# EasyEDA Pro project energymonitor.eprj, board PCB_1
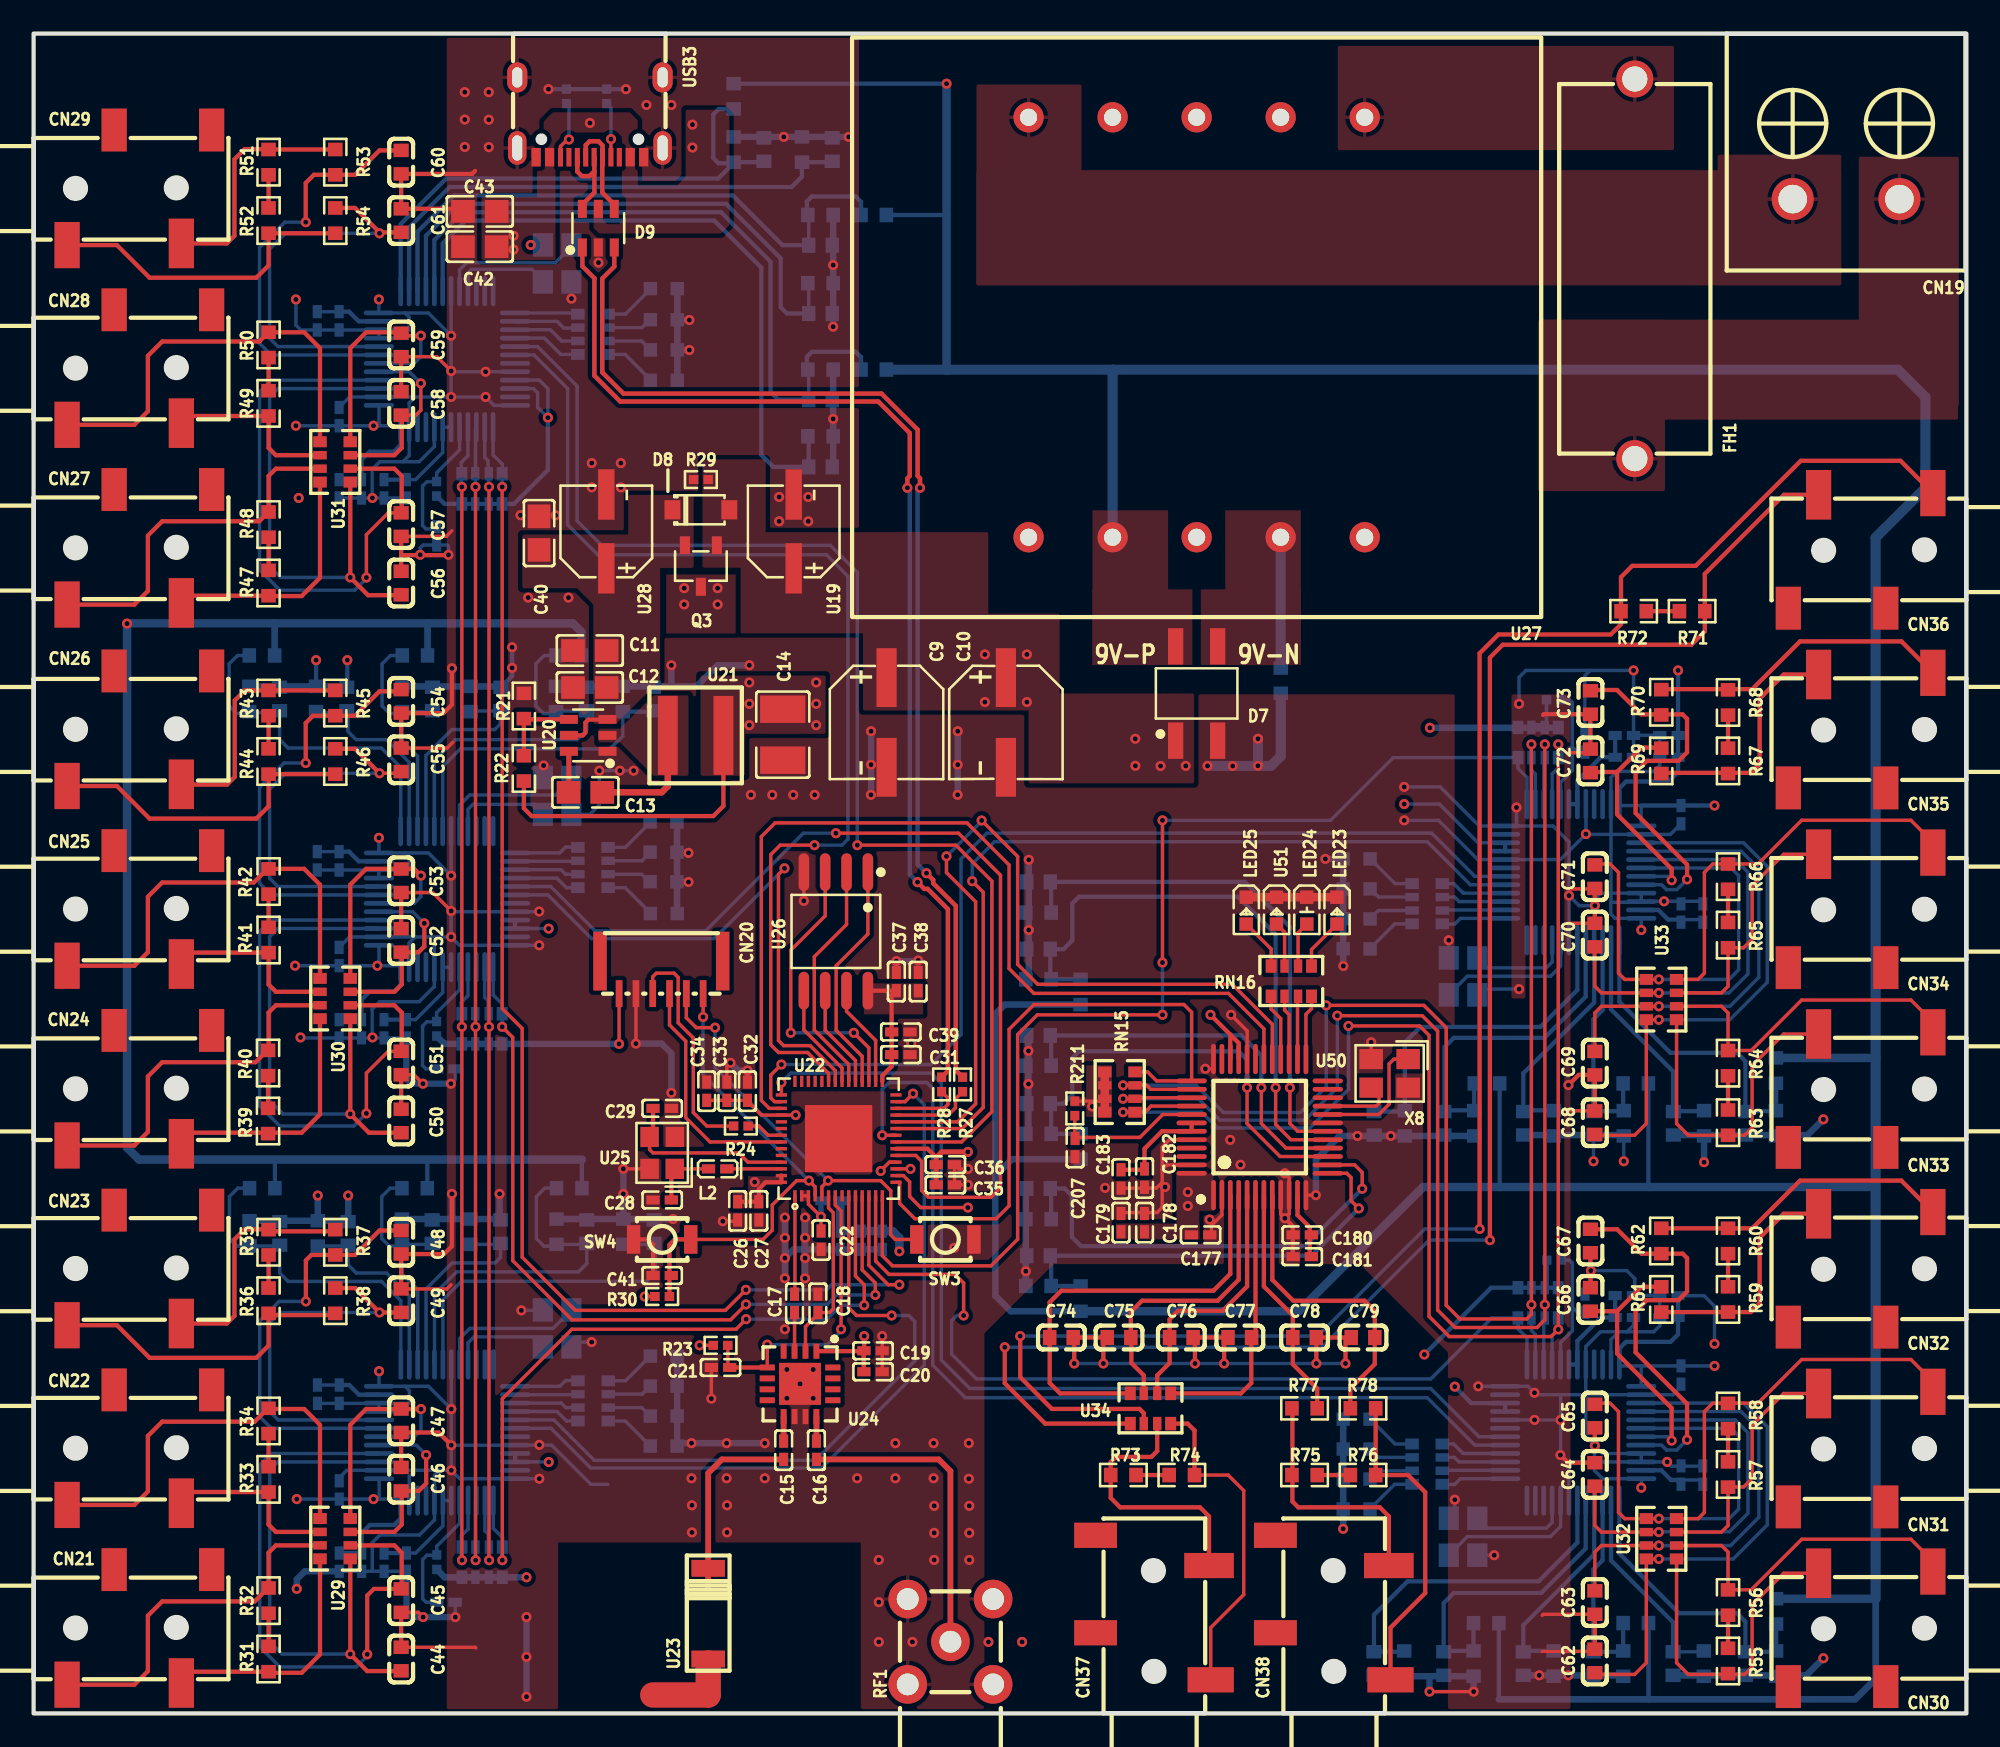
[diagram p6: board, top side]
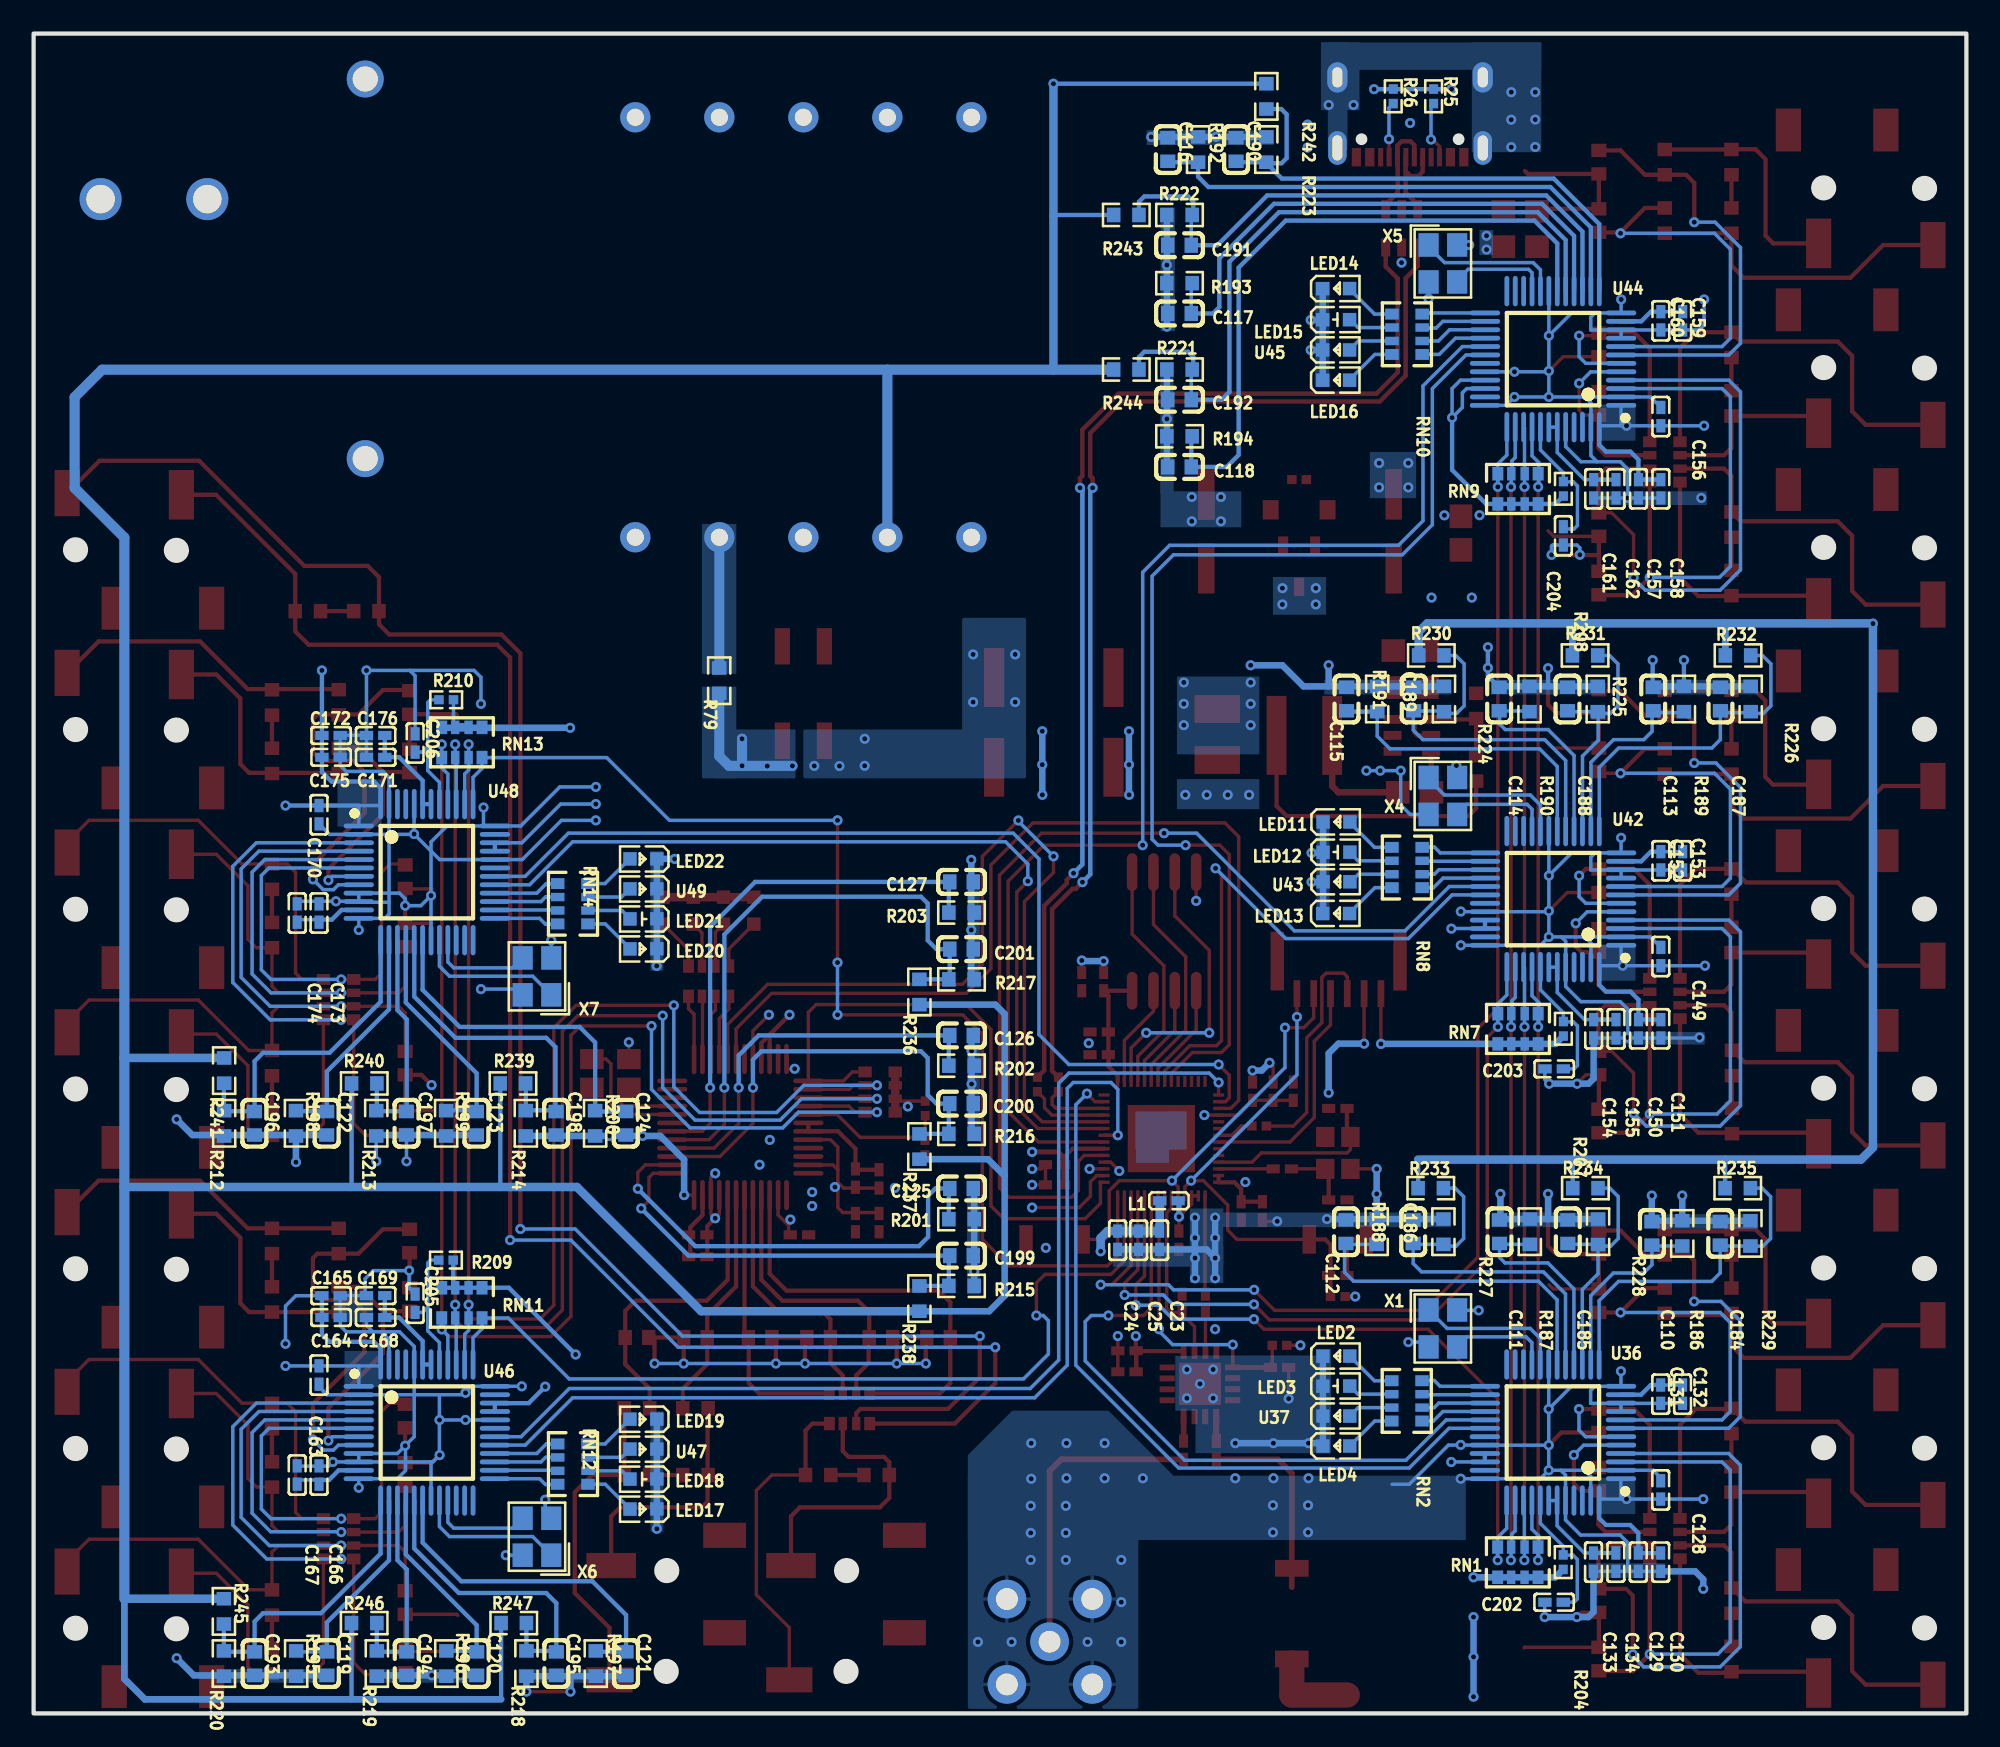
[diagram p7: board, bottom side, seen from below]

Outline 115 x 100 mm; copper layers: Top Layer, Inner1, Inner2, Bottom Layer. Coordinates in mm from the lower left corner of the outline.
Outline path: rectangle 0,100 115,0
Stack: Top Layer 0.035mm Outer layer thickness 1oz / Dielectric1 0.2104mm 7628 RC49% 8.6mil / Inner1 0.0152mm Inner layer thickness / Dielectric2 1.065mm 1.1mm H/HOZ Copper / Inner2 0.0152mm Inner layer thickness / Dielectric3 0.2104mm 7628 RC49% 8.6mil / Bottom Layer 0.035mm Outer layer thickness 1oz

## Design rules (mm)
net ANT1: 50 OHM
net ANT2: 50 OHM
net $1N20967: DP1
net $1N20955: DP1
net USB_D_N: DP2
net USB_D_P: DP2
template: User Custom Config
spacing copperThickness1oz (default): track to track 0.152, other pairs 0.152 to 0.3
spacing copperThickness2oz: track to track 0.203, other pairs 0.152 to 0.3
track width copperThickness1oz (default): min 0.203, default 0.203, max 0.6
track width copperThickness2oz: min 0.203, default 0.254, max 2.54
track width 50OHM: min 0.343, default 0.343, max 0.343
differential pair USB Diff (default): width min 0.267, default 0.267, max 0.267; gap min 0.203, default 0.203
via viaSize (default): diameter min 0.6, default 0.6, max 0.6; hole min 0.3, default 0.3, max 0.3
['net', 'ant1'] ['NET', 'ANT2'] uses default

## Placement (name value [footprint] x y rotation side)
C9  220uF  [CAP-SMD_BD6.3-L6.6-W6.6-FD]  57.85 58.99 270 top
C10  220uF  [CAP-SMD_BD6.3-L6.6-W6.6-FD]  50.75 58.99 270 top
C11  2.2uF  [C0805]  33.1 63.27 0 top
C12  100nF  [C0805]  33.1 61.07 0 top
C13  100nF  [C0805]  32.83 54.83 0 top
C14  100uF  [C1210]  44.57 58.26 90 top
C15  100pF  [C0402]  44.63 15.67 270 top
C16  100pF  [C0402]  46.58 15.67 270 top
C17  100pF  [C0402]  45.28 24.41 270 top
C18  100pF  [C0402]  46.67 24.41 270 top
C19  100pF  [C0402]  49.94 21.59 180 top
C20  100nF  [C0402]  49.94 20.34 180 top
C21  100pF  [C0402]  40.87 20.59 0 top
C22  100nF  [C0402]  46.85 28.17 90 top
C23  100nF  [C0402]  48 28.17 90 bottom
C24  10uF  [C0402]  50.5 28.17 90 bottom
C25  1uF  [C0402]  49.25 28.17 90 bottom
C26  1uF  [C0402]  41.89 29.92 90 top
C27  10nF  [C0402]  43.15 29.92 270 top
C28  10pF  [C0402]  37.4 30.57 0 top
C29  10pF  [C0402]  37.4 36.02 180 top
C31  100nF  [C0402]  51.6 39.22 180 top
C32  100nF  [C0402]  42.48 37.04 270 top
C33  1uF  [C0402]  41.25 37.04 270 top
C34  10uF  [C0402]  40.05 37.04 270 top
C35  10uF  [C0402]  54.25 31.47 180 top
C36  100nF  [C0402]  54.25 32.67 180 top
C37  100nF  [C0402]  51.33 43.57 270 top
C38  10uF  [C0402]  52.63 43.57 270 top
C39  1uF  [C0402]  51.6 40.57 180 top
C40  100nF  [C0805]  30.07 70.26 270 top
C41  1uF  [C0402]  37.4 26.07 0 top
C42  2.2uF  [C0805]  26.55 87.32 0 top
C43  100nF  [C0805]  26.55 89.42 0 top
C44  330nF  [C0603]  21.87 3.24 90 top
C45  330nF  [C0603]  21.87 6.71 90 top
C46  330nF  [C0603]  21.87 13.94 90 top
C47  330nF  [C0603]  21.87 17.42 90 top
C48  330nF  [C0603]  21.87 28.05 270 top
C49  330nF  [C0603]  21.87 24.57 270 top
C50  330nF  [C0603]  21.87 35.27 90 top
C51  330nF  [C0603]  21.87 38.72 90 top
C52  330nF  [C0603]  21.87 46.02 90 top
C53  330nF  [C0603]  21.87 49.57 90 top
C54  330nF  [C0603]  21.87 60.25 270 top
C55  330nF  [C0603]  21.87 56.77 270 top
C56  330nF  [C0603]  21.87 67.29 90 top
C57  330nF  [C0603]  21.87 70.77 90 top
C58  330nF  [C0603]  21.87 77.99 90 top
C59  330nF  [C0603]  21.87 81.47 90 top
C60  330nF  [C0603]  21.87 92.35 270 top
C61  330nF  [C0603]  21.87 88.87 270 top
C62  330nF  [C0603]  92.89 3.12 90 top
C63  330nF  [C0603]  92.89 6.6 90 top
C64  330nF  [C0603]  92.89 14.22 90 top
C65  330nF  [C0603]  92.89 17.7 90 top
C66  330nF  [C0603]  92.63 24.64 90 top
C67  330nF  [C0603]  92.63 28.12 90 top
C68  330nF  [C0603]  92.89 35.17 90 top
C69  330nF  [C0603]  92.89 38.71 90 top
C70  330nF  [C0603]  92.89 46.33 90 top
C71  330nF  [C0603]  92.89 49.81 90 top
C72  330nF  [C0603]  92.63 56.7 90 top
C73  330nF  [C0603]  92.63 60.18 90 top
C74  330nF  [C0603]  61.15 22.38 0 top
C75  330nF  [C0603]  64.58 22.38 0 top
C76  330nF  [C0603]  68.29 22.38 0 top
C77  330nF  [C0603]  71.77 22.38 0 top
C78  330nF  [C0603]  75.62 22.38 0 top
C79  330nF  [C0603]  79.1 22.38 0 top
C110  18nF  [C0603]  18.71 28.58 270 bottom
C111  18nF  [C0603]  27.78 28.68 270 bottom
C112  18nF  [C0603]  36.92 28.68 270 bottom
C113  18nF  [C0603]  18.63 60.39 270 bottom
C114  18nF  [C0603]  27.8 60.39 270 bottom
C115  18nF  [C0603]  36.88 60.39 270 bottom
C116  18nF  [C0603]  47.52 93.1 270 bottom
C117  18nF  [C0603]  46.82 83.34 180 bottom
C118  18nF  [C0603]  46.82 74.2 180 bottom
C119  18nF  [C0603]  97.55 2.97 90 bottom
C120  18nF  [C0603]  88.64 2.97 90 bottom
C121  18nF  [C0603]  79.75 2.97 90 bottom
C122  18nF  [C0603]  97.56 35.13 90 bottom
C123  18nF  [C0603]  88.65 35.13 90 bottom
C124  18nF  [C0603]  79.76 35.13 90 bottom
C125  18nF  [C0603]  59.79 31.25 0 bottom
C126  18nF  [C0603]  59.79 40.36 0 bottom
C127  18nF  [C0603]  59.79 49.5 0 bottom
C128  100nF  [C0402]  18.19 13.3 270 bottom
C129  100nF  [C0402]  19.52 9 90 bottom
C130  10uF  [C0402]  18.19 9 90 bottom
C131  100nF  [C0402]  18.19 19 90 bottom
C132  10uF  [C0402]  16.89 19 90 bottom
C133  100nF  [C0402]  22.19 9 90 bottom
C134  10uF  [C0402]  20.86 9 90 bottom
C149  100nF  [C0402]  18.18 45.06 270 bottom
C150  100nF  [C0402]  19.51 40.76 90 bottom
C151  10uF  [C0402]  18.18 40.76 90 bottom
C152  100nF  [C0402]  18.18 50.76 90 bottom
C153  10uF  [C0402]  16.88 50.76 90 bottom
C154  100nF  [C0402]  22.18 40.76 90 bottom
C155  10uF  [C0402]  20.85 40.76 90 bottom
C156  100nF  [C0402]  18.18 77.2 270 bottom
C157  100nF  [C0402]  19.51 72.9 90 bottom
C158  10uF  [C0402]  18.18 72.9 90 bottom
C159  100nF  [C0402]  16.88 82.9 90 bottom
C160  10uF  [C0402]  18.18 82.9 90 bottom
C161  100nF  [C0402]  22.18 72.9 90 bottom
C162  10uF  [C0402]  20.85 72.9 90 bottom
C163  100nF  [C0402]  98.02 20.14 90 bottom
C164  100nF  [C0402]  97.3 23.57 0 bottom
C165  10uF  [C0402]  97.3 24.87 0 bottom
C166  100nF  [C0402]  98.02 14.19 270 bottom
C167  10uF  [C0402]  99.32 14.19 270 bottom
C168  100nF  [C0402]  94.65 23.57 180 bottom
C169  10uF  [C0402]  94.65 24.87 180 bottom
C170  100nF  [C0402]  98.02 53.5 90 bottom
C171  100nF  [C0402]  97.3 56.92 0 bottom
C172  10uF  [C0402]  97.3 58.22 0 bottom
C173  100nF  [C0402]  98.02 47.65 270 bottom
C174  10uF  [C0402]  99.32 47.65 270 bottom
C175  100nF  [C0402]  94.65 56.92 180 bottom
C176  10uF  [C0402]  94.65 58.22 180 bottom
C177  100nF  [C0402]  69.43 28.49 180 top
C178  100nF  [C0402]  66.1 29.22 270 top
C179  10uF  [C0402]  64.7 29.22 270 top
C180  100nF  [C0402]  75.48 28.49 0 top
C181  10uF  [C0402]  75.48 27.19 0 top
C182  100nF  [C0402]  66.1 31.87 90 top
C183  10uF  [C0402]  64.7 31.82 90 top
C184  18nF  [C0603]  14.65 28.58 270 bottom
C185  18nF  [C0603]  23.72 28.68 270 bottom
C186  18nF  [C0603]  32.92 28.68 270 bottom
C187  18nF  [C0603]  14.63 60.39 270 bottom
C188  18nF  [C0603]  23.73 60.39 270 bottom
C189  18nF  [C0603]  32.88 60.39 270 bottom
C190  18nF  [C0603]  43.45 93.1 270 bottom
C191  18nF  [C0603]  46.82 87.4 180 bottom
C192  18nF  [C0603]  46.82 78.2 180 bottom
C193  18nF  [C0603]  101.85 2.97 90 bottom
C194  18nF  [C0603]  92.8 2.97 90 bottom
C195  18nF  [C0603]  83.9 2.97 90 bottom
C196  18nF  [C0603]  101.86 35.13 90 bottom
C197  18nF  [C0603]  92.81 35.13 90 bottom
C198  18nF  [C0603]  83.91 35.13 90 bottom
C199  18nF  [C0603]  59.79 27.25 0 bottom
C200  18nF  [C0603]  59.79 36.3 0 bottom
C201  18nF  [C0603]  59.79 45.5 0 bottom
C202  100nF  [C0402]  24.53 6.62 180 bottom
C203  100nF  [C0402]  24.53 38.37 180 bottom
C204  100nF  [C0402]  23.98 70.1 90 bottom
C205  100nF  [C0402]  92.3 24.42 270 bottom
C206  100nF  [C0402]  92.3 57.77 270 bottom
C207  100nF  [C0402]  61.97 33.68 90 top
CN19  DBT50G-6.35-2P-BK-P OGC  [CONN-TH_2P-P6.35_DBT50G-6.35-2P-BK-P]  107.84 90.15 180 top
CN20  1.0T-6P立贴  [CONN-SMD_1.0T-6P-LT]  37.35 43.82 180 top
CN21  PJ-35825-SMT  [AUDIO-SMD_PJ-35825]  6.29 5.13 0 top
CN22  PJ-35825-SMT  [AUDIO-SMD_PJ-35825]  6.29 15.83 0 top
CN23  PJ-35825-SMT  [AUDIO-SMD_PJ-35825]  6.29 26.53 0 top
CN24  PJ-35825-SMT  [AUDIO-SMD_PJ-35825]  6.29 37.23 0 top
CN25  PJ-35825-SMT  [AUDIO-SMD_PJ-35825]  6.29 47.93 0 top
CN26  PJ-35825-SMT  [AUDIO-SMD_PJ-35825]  6.29 58.63 0 top
CN27  PJ-35825-SMT  [AUDIO-SMD_PJ-35825]  6.29 69.43 0 top
CN28  PJ-35825-SMT  [AUDIO-SMD_PJ-35825]  6.29 80.13 0 top
CN29  PJ-35825-SMT  [AUDIO-SMD_PJ-35825]  6.29 90.83 0 top
CN30  PJ-35825-SMT  [AUDIO-SMD_PJ-35825]  108.71 5.02 180 top
CN31  PJ-35825-SMT  [AUDIO-SMD_PJ-35825]  108.71 15.72 180 top
CN32  PJ-35825-SMT  [AUDIO-SMD_PJ-35825]  108.71 26.42 180 top
CN33  PJ-35825-SMT  [AUDIO-SMD_PJ-35825]  108.71 37.12 180 top
CN34  PJ-35825-SMT  [AUDIO-SMD_PJ-35825]  108.71 47.82 180 top
CN35  PJ-35825-SMT  [AUDIO-SMD_PJ-35825]  108.71 58.52 180 top
CN36  PJ-35825-SMT  [AUDIO-SMD_PJ-35825]  108.71 69.22 180 top
CN37  PJ-35825-SMT  [AUDIO-SMD_PJ-35825]  66.61 6.3 90 top
CN38  PJ-35825-SMT  [AUDIO-SMD_PJ-35825]  77.31 6.3 90 top
D7  MB36F  [MBF_L4.8-W3.9-P2.50-LS6.7-TR]  69.2 60.72 180 top
D8  DSK34  [SOD-123_L2.8-W1.8-LS3.7-RD]  39.7 71.65 0 top
D9  USBLC6-2SC6  [SOT-23-6_L2.9-W1.6-P0.95-LS2.8-BL]  33.6 88.42 0 top
FH1  PTF-15  [FUSE-TH_L22.0-W9.0-P22.60]  95.27 86 90 top
L1  2nH  [L0402]  47.45 30.52 180 bottom
L2  24nH  [L0402-RD]  40.7 32.42 180 top
LED2  NCD0603R1  [LED0603-RD_RED]  37.49 21.27 180 bottom
LED3  NCD0603G1  [LED0603-RD_1]  37.49 19.48 180 bottom
LED4  NCD0603Y1  [LED0603-RD]  37.49 15.92 180 bottom
LED11  NCD0603R1  [LED0603-RD_RED]  37.48 53.07 180 bottom
LED12  NCD0603G1  [LED0603-RD_1]  37.48 51.27 180 bottom
LED13  NCD0603Y1  [LED0603-RD]  37.5 47.62 180 bottom
LED14  NCD0603R1  [LED0603-RD_RED]  37.5 84.82 180 bottom
LED15  NCD0603G1  [LED0603-RD_1]  37.5 82.97 180 bottom
LED16  NCD0603Y1  [LED0603-RD]  37.5 79.37 180 bottom
LED17  NCD0603R1  [LED0603-RD_RED]  78.72 12.17 0 bottom
LED18  NCD0603G1  [LED0603-RD_1]  78.72 13.95 0 bottom
LED19  NCD0603Y1  [LED0603-RD]  78.72 17.52 0 bottom
LED20  NCD0603R1  [LED0603-RD_RED]  78.72 45.51 0 bottom
LED21  NCD0603G1  [LED0603-RD_1]  78.72 47.3 0 bottom
LED22  NCD0603Y1  [LED0603-RD]  78.72 50.87 0 bottom
LED23  NCD0603R1  [LED0603-RD_RED]  77.55 47.79 270 top
LED24  NCD0603G1  [LED0603-RD_1]  75.75 47.79 270 top
LED25  NCD0603Y1  [LED0603-RD]  72.15 47.79 270 top
Q3  G7P03L  [SOT-23-3_L2.9-W1.6-P1.90-LS2.8-BR]  39.7 68.3 90 top
R21  22.1kΩ  [R0603]  29.17 59.97 270 top
R22  100kΩ  [R0603]  29.17 56.26 270 top
R23  10kΩ  [R0402]  40.87 21.91 180 top
R24  499Ω  [R0402]  42.08 34.97 180 top
R25  5.1kΩ  [R0402]  31.7 96.27 270 bottom
R26  5.1kΩ  [R0402]  34.1 96.27 90 bottom
R27  0Ω  [R0402]  55.28 37.44 270 top
R28  0Ω  [R0402]  54.03 37.44 270 top
R29  10kΩ  [R0402]  39.7 73.45 0 top
R30  10kΩ  [R0402]  37.4 24.82 180 top
R31  22Ω  [R0603]  13.98 3.24 90 top
R32  0Ω  [R0603]  13.98 6.71 90 top
R33  22Ω  [R0603]  13.98 13.93 90 top
R34  0Ω  [R0603]  13.98 17.41 90 top
R35  22Ω  [R0603]  13.98 28.05 270 top
R36  0Ω  [R0603]  13.98 24.57 270 top
R37  100Ω  [R0603]  17.95 28.05 270 top
R38  100Ω  [R0603]  17.95 24.57 90 top
R39  22Ω  [R0603]  13.95 35.27 90 top
R40  0Ω  [R0603]  13.95 38.72 90 top
R41  22Ω  [R0603]  13.98 46.04 90 top
R42  0Ω  [R0603]  13.98 49.52 90 top
R43  22Ω  [R0603]  13.98 60.15 270 top
R44  0Ω  [R0603]  13.98 56.67 270 top
R45  100Ω  [R0603]  17.95 60.15 270 top
R46  100Ω  [R0603]  17.95 56.67 90 top
R47  22Ω  [R0603]  13.98 67.29 90 top
R48  0Ω  [R0603]  13.98 70.77 90 top
R49  22Ω  [R0603]  13.98 77.99 90 top
R50  0Ω  [R0603]  13.98 81.47 90 top
R51  22Ω  [R0603]  13.98 92.35 270 top
R52  0Ω  [R0603]  13.98 88.87 270 top
R53  100Ω  [R0603]  17.95 92.35 270 top
R54  100Ω  [R0603]  17.95 88.87 90 top
R55  22Ω  [R0603]  100.82 3.12 90 top
R56  0Ω  [R0603]  100.82 6.6 90 top
R57  22Ω  [R0603]  100.82 14.22 90 top
R58  0Ω  [R0603]  100.82 17.7 90 top
R59  22Ω  [R0603]  100.82 24.64 90 top
R60  0Ω  [R0603]  100.82 28.12 90 top
R61  100Ω  [R0603]  96.85 24.64 90 top
R62  100Ω  [R0603]  96.85 28.12 270 top
R63  22Ω  [R0603]  100.82 35.17 90 top
R64  0Ω  [R0603]  100.82 38.71 90 top
R65  22Ω  [R0603]  100.82 46.33 90 top
R66  0Ω  [R0603]  100.82 49.81 90 top
R67  22Ω  [R0603]  100.82 56.7 90 top
R68  0Ω  [R0603]  100.82 60.18 90 top
R69  100Ω  [R0603]  96.85 56.7 90 top
R70  100Ω  [R0603]  96.85 60.19 270 top
R71  22Ω  [R0603]  98.68 65.62 180 top
R72  0Ω  [R0603]  95.2 65.62 180 top
R73  22Ω  [R0603]  64.84 14.19 0 top
R74  0Ω  [R0603]  68.32 14.19 0 top
R75  22Ω  [R0603]  75.62 14.19 0 top
R76  0Ω  [R0603]  79.1 14.19 0 top
R77  100Ω  [R0603]  75.62 18.16 0 top
R78  100Ω  [R0603]  79.1 18.16 180 top
R79  0Ω  [R0603]  74.21 61.48 270 bottom
R186  1kΩ  [R0603]  16.91 28.58 270 bottom
R187  1kΩ  [R0603]  25.98 28.68 270 bottom
R188  1kΩ  [R0603]  35.09 28.68 270 bottom
R189  1kΩ  [R0603]  16.81 60.39 270 bottom
R190  1kΩ  [R0603]  25.99 60.39 270 bottom
R191  1kΩ  [R0603]  35.06 60.39 270 bottom
R192  1kΩ  [R0603]  45.71 93.1 270 bottom
R193  1kΩ  [R0603]  46.82 85.14 180 bottom
R194  1kΩ  [R0603]  46.82 76.03 180 bottom
R195  1kΩ  [R0603]  99.38 2.97 90 bottom
R196  1kΩ  [R0603]  90.44 2.97 90 bottom
R197  1kΩ  [R0603]  81.55 2.97 90 bottom
R198  1kΩ  [R0603]  99.39 35.13 90 bottom
R199  1kΩ  [R0603]  90.45 35.13 90 bottom
R200  1kΩ  [R0603]  81.59 35.13 90 bottom
R201  1kΩ  [R0603]  59.79 29.42 0 bottom
R202  1kΩ  [R0603]  59.79 38.56 0 bottom
R203  1kΩ  [R0603]  59.79 47.67 0 bottom
R204  10kΩ  [R0402]  23.99 9 90 bottom
R207  10kΩ  [R0402]  23.98 40.76 90 bottom
R208  10kΩ  [R0402]  23.98 72.9 90 bottom
R209  10kΩ  [R0402]  90.47 26.98 0 bottom
R210  10kΩ  [R0402]  90.45 60.34 0 bottom
R211  10kΩ  [R0402]  61.95 36.02 270 top
R212  1kΩ  [R0603]  103.66 35.13 90 bottom
R213  1kΩ  [R0603]  94.61 35.13 90 bottom
R214  1kΩ  [R0603]  85.71 35.13 90 bottom
R215  1kΩ  [R0603]  59.79 25.45 0 bottom
R216  1kΩ  [R0603]  59.79 34.5 0 bottom
R217  1kΩ  [R0603]  59.79 43.7 0 bottom
R218  1kΩ  [R0603]  85.68 2.97 90 bottom
R219  1kΩ  [R0603]  94.58 2.97 90 bottom
R220  1kΩ  [R0603]  103.68 2.97 90 bottom
R221  1kΩ  [R0603]  46.82 80 180 bottom
R222  1kΩ  [R0603]  46.82 89.2 180 bottom
R223  1kΩ  [R0603]  41.65 93.1 270 bottom
R224  1kΩ  [R0603]  31.08 60.39 270 bottom
R225  1kΩ  [R0603]  21.93 60.39 270 bottom
R226  1kΩ  [R0603]  12.83 60.39 270 bottom
R227  1kΩ  [R0603]  31.12 28.68 270 bottom
R228  1kΩ  [R0603]  21.92 28.68 270 bottom
R229  1kΩ  [R0603]  12.85 28.58 270 bottom
R230  68kΩ  [R0603]  31.84 62.98 0 bottom
R231  68kΩ  [R0603]  22.69 62.98 0 bottom
R232  68kΩ  [R0603]  13.59 62.98 0 bottom
R233  68kΩ  [R0603]  31.87 31.27 0 bottom
R234  68kΩ  [R0603]  22.67 31.27 0 bottom
R235  68kΩ  [R0603]  13.6 31.27 0 bottom
R236  68kΩ  [R0603]  62.3 42.95 270 bottom
R237  68kΩ  [R0603]  62.3 33.75 270 bottom
R238  68kΩ  [R0603]  62.3 24.7 270 bottom
R239  68kΩ  [R0603]  86.48 37.5 0 bottom
R240  68kΩ  [R0603]  95.33 37.5 0 bottom
R241  68kΩ  [R0603]  103.66 38.27 90 bottom
R242  68kΩ  [R0603]  41.65 96.26 90 bottom
R243  68kΩ  [R0603]  49.99 89.2 0 bottom
R244  68kΩ  [R0603]  49.99 80 0 bottom
R245  68kΩ  [R0603]  103.68 6.07 90 bottom
R246  68kΩ  [R0603]  95.33 5.38 0 bottom
R247  68kΩ  [R0603]  86.43 5.38 0 bottom
RF1  KH-SMA-K513-G  [ANT-TH_KH-SMA-K513-G]  54.55 4.27 90 top
RN1  10kΩ  [RES-ARRAY-SMD_0603-8P-L3.2-W1.6-BL]  26.69 9 0 bottom
RN2  1kΩ  [RES-ARRAY-SMD_0603-8P-L3.2-W1.6-BL]  33.29 18.6 90 bottom
RN7  10kΩ  [RES-ARRAY-SMD_0603-8P-L3.2-W1.6-BL]  26.68 40.76 0 bottom
RN8  1kΩ  [RES-ARRAY-SMD_0603-8P-L3.2-W1.6-BL]  33.28 50.36 90 bottom
RN9  10kΩ  [RES-ARRAY-SMD_0603-8P-L3.2-W1.6-BL]  26.68 72.9 0 bottom
RN10  1kΩ  [RES-ARRAY-SMD_0603-8P-L3.2-W1.6-BL]  33.28 82.1 90 bottom
RN11  10kΩ  [RES-ARRAY-SMD_0603-8P-L3.2-W1.6-BL]  89.52 24.44 180 bottom
RN12  1kΩ  [RES-ARRAY-SMD_0603-8P-L3.2-W1.6-BL]  82.92 14.84 270 bottom
RN13  10kΩ  [RES-ARRAY-SMD_0603-8P-L3.2-W1.6-BL]  89.52 57.8 180 bottom
RN14  1kΩ  [RES-ARRAY-SMD_0603-8P-L3.2-W1.6-BL]  82.92 48.2 270 bottom
RN15  10kΩ  [RES-ARRAY-SMD_0603-8P-L3.2-W1.6-BL]  64.63 36.99 90 top
RN16  1kΩ  [RES-ARRAY-SMD_0603-8P-L3.2-W1.6-BL]  74.83 43.59 0 top
SW3  B3U-1000P  [KEY-SMD_B3U-1000PM]  54.25 28.22 0 top
SW4  B3U-1000P  [KEY-SMD_B3U-1000PM]  37.4 28.22 180 top
U19  47uF  [CAP-SMD_BD5.0-L5.3-W5.3-LS6.7-FD]  45.22 70.36 90 top
U20  LMR51430XDDCR  [SOT-23-6_L2.9-W1.6-P0.95-LS2.8-BL]  33 58.22 90 top
U21  5.6uH  [IND-SMD_L5.5-W5.3]  39.39 58.22 0 top
U22  ESP32-S3R8  [QFN-56_L7.0-W7.0-P0.40-TL-EP4.0]  47.9 34.22 90 top
U23  RFANT5220110A0T  [FILTER-SMD_L5.2-W2.0-L]  40.14 5.94 270 top
U24  HMC8038LP4CETR  [LFCSP-16_L4.0-W4.0-P0.65-BL-EP]  45.6 19.62 180 top
U25  40MHz  [CRYSTAL-SMD_4P-L2.5-W2.0-BL]  37.4 33.37 90 top
U26  W25Q128JVSIQ  [SOIC-8_L5.3-W5.3-P1.27-LS8.0-BL]  47.73 46.55 180 top
U27  -  [PE3828-M]  69.2 82.52 180 top
U28  47uF  [CAP-SMD_BD5.0-L5.3-W5.3-LS6.7-FD]  34.07 70.36 90 top
U29  100Ω  [RES-ARRAY-SMD_0603-8P-L3.2-W1.6-BL]  17.94 10.4 270 top
U30  100Ω  [RES-ARRAY-SMD_0603-8P-L3.2-W1.6-BL]  17.94 42.56 270 top
U31  100Ω  [RES-ARRAY-SMD_0603-8P-L3.2-W1.6-BL]  17.94 74.5 270 top
U32  100Ω  [RES-ARRAY-SMD_0603-8P-L3.2-W1.6-BL]  96.86 10.39 90 top
U33  100Ω  [RES-ARRAY-SMD_0603-8P-L3.2-W1.6-BL]  96.86 42.49 90 top
U34  100Ω  [RES-ARRAY-SMD_0603-8P-L3.2-W1.6-BL]  66.45 18.15 0 top
U36  ATM90E32AS-AU-R  [TQFP-48_L7.0-W7.0-P0.50-LS9.0-BL]  24.6 16.72 90 bottom
U37  NCD0603B5  [LED0603-RD]  37.49 17.7 180 bottom
U42  ATM90E32AS-AU-R  [TQFP-48_L7.0-W7.0-P0.50-LS9.0-BL]  24.59 48.48 90 bottom
U43  NCD0603B5  [LED0603-RD]  37.48 49.51 180 bottom
U44  ATM90E32AS-AU-R  [TQFP-48_L7.0-W7.0-P0.50-LS9.0-BL]  24.59 80.62 90 bottom
U45  NCD0603B5  [LED0603-RD]  37.5 81.17 180 bottom
U46  ATM90E32AS-AU-R  [TQFP-48_L7.0-W7.0-P0.50-LS9.0-BL]  91.6 16.72 270 bottom
U47  NCD0603B5  [LED0603-RD]  78.72 15.73 0 bottom
U48  ATM90E32AS-AU-R  [TQFP-48_L7.0-W7.0-P0.50-LS9.0-BL]  91.6 50.08 270 bottom
U49  NCD0603B5  [LED0603-RD]  78.72 49.08 0 bottom
U50  ATM90E32AS-AU-R  [TQFP-48_L7.0-W7.0-P0.50-LS9.0-BL]  72.95 34.9 0 top
U51  NCD0603B5  [LED0603-RD]  73.95 47.79 270 top
USB3  -  [USB-C-SMD_TYPE-C-6PIN-2MD-073]  33.1 95.02 180 top
X1  16.384MHz  [CRYSTAL-SMD_4P-L3.2-W2.5-BL]  31.15 22.92 270 bottom
X4  16.384MHz  [CRYSTAL-SMD_4P-L3.2-W2.5-BL]  31.15 54.62 270 bottom
X5  16.384MHz  [CRYSTAL-SMD_4P-L3.2-W2.5-BL]  31.15 86.32 270 bottom
X6  16.384MHz  [CRYSTAL-SMD_4P-L3.2-W2.5-BL]  85.05 10.52 90 bottom
X7  16.384MHz  [CRYSTAL-SMD_4P-L3.2-W2.5-BL]  85.05 43.88 90 bottom
X8  16.384MHz  [CRYSTAL-SMD_4P-L3.2-W2.5-BL]  80.68 38.1 180 top

## Footprints (pads in the part's own frame, mm; a bottom-side part is the same pattern mirrored in y, then rotated)
ANT-TH_KH-SMA-K513-G
  round 2.3 hole 1.3: 1(-2.54,-2.54) 2(-2.54,2.54) 3(2.54,2.54) 4(2.54,-2.54) 5(0,0)
AUDIO-SMD_PJ-35825
  rect 1.5x2.75 smd: 1(-4.3,-3.425)
  rect 1.5x2.95 smd: 2(2.5,-3.325)
  rect 1.5x2.55 smd: 3(4.3,3.425) 4(-1.5,3.425)
C0402
  rect 0.79x0.54 smd: 1(-0.545,0) 2(0.545,0)
C0603
  rect 0.8x0.9 smd: 1(-0.7,0) 2(0.7,0)
C0805
  rect 1.41x1.35 smd: 1(-1,0) 2(1,0)
C1210
  rect 1.635x2.7 smd: 1(-1.518,0) 2(1.518,0)
CAP-SMD_BD5.0-L5.3-W5.3-LS6.7-FD
  rect 3x0.98 smd: 1(-2.2,0) 2(2.2,0)
CAP-SMD_BD6.3-L6.6-W6.6-FD
  rect 3.5x1.2 smd: 1(-2.67,0) 2(2.67,0)
CONN-SMD_1.0T-6P-LT
  rect 0.8x3.5 smd: 0(-3.65,-0.969) 0(3.65,-0.966)
  rect 0.4x1.6 smd: 1(-2.486,0.969) 2(-1.486,0.969) 3(-0.486,0.969) 4(0.513,0.969) 5(1.514,0.969) 6(2.514,0.969)
CONN-TH_2P-P6.35_DBT50G-6.35-2P-BK-P
  round 2.5 hole 1.7: 1(-3.175,0) 2(3.175,0)
CRYSTAL-SMD_4P-L2.5-W2.0-BL
  rect 1.2x1.1 smd: 1(-0.95,-0.75) 2(0.95,-0.75) 3(0.95,0.75) 4(-0.95,0.75)
CRYSTAL-SMD_4P-L3.2-W2.5-BL
  rect 1.4x1.2 smd: 1(-1.1,-0.85) 2(1.1,-0.85) 3(1.1,0.85) 4(-1.1,0.85)
FILTER-SMD_L5.2-W2.0-L
  rect 1x2 smd: 1(-2.7,0) 2(2.7,0)
FUSE-TH_L22.0-W9.0-P22.60
  round 2.2 hole 1.5: 1(-11.3,0) 2(11.3,0)
IND-SMD_L5.5-W5.3
  rect 1.18x4.7 smd: 1(-1.655,0) 2(1.655,0)
KEY-SMD_B3U-1000PM
  rect 0.8x1.7 smd: 1(-1.7,0) 2(1.7,0)
L0402
  rect 0.79x0.54 smd: 1(-0.545,0) 2(0.545,0)
L0402-RD
  rect 0.79x0.54 smd: 1(-0.545,0) 2(0.545,0)
LED0603-RD
  rect 0.8x0.8 smd: 1(-0.799,0) 2(0.799,0)
LED0603-RD_1
  rect 0.8x0.8 smd: 1(-0.799,-0.004) 2(0.799,0.004)
LED0603-RD_RED
  rect 0.8x0.8 smd: 1(-0.799,-0.004) 2(0.799,0.004)
LFCSP-16_L4.0-W4.0-P0.65-BL-EP
  rect 0.35x0.9 smd: 1(-0.975,-1.95) 2(-0.325,-1.95) 3(0.325,-1.95) 4(0.975,-1.95) 9(0.975,1.95) 10(0.325,1.95) 11(-0.325,1.95) 12(-0.975,1.95)
  rect 0.9x0.35 smd: 5(1.95,-0.975) 6(1.95,-0.325) 7(1.95,0.325) 8(1.95,0.975) 13(-1.95,0.975) 14(-1.95,0.325) 15(-1.95,-0.325) 16(-1.95,-0.975)
  rect 2.5x2.5 smd: 17(0,0)
MBF_L4.8-W3.9-P2.50-LS6.7-TR
  rect 0.91x2.165 smd: 1(1.25,2.808) 2(1.25,-2.808) 3(-1.25,2.808) 4(-1.25,-2.808)
PE3828-M
  round 1.8 hole 1.02: 1(-10,-12.5) 2(-5,-12.5) 3(0,-12.5) 4(5,-12.5) 5(10,-12.5) 6(10,12.5) 7(5,12.5) 8(0,12.5) 9(-5,12.5) 10(-10,12.5)
QFN-56_L7.0-W7.0-P0.40-TL-EP4.0
  rect 0.665x0.2 smd: 1(-3.408,2.6) 2(-3.408,2.2) 3(-3.408,1.8) 4(-3.408,1.4) 5(-3.408,1) 6(-3.408,0.6) 7(-3.408,0.2) 8(-3.408,-0.2) 9(-3.408,-0.6) 10(-3.408,-1) 11(-3.408,-1.4) 12(-3.408,-1.8) 13(-3.408,-2.2) 14(-3.408,-2.6) 29(3.408,-2.6) 30(3.408,-2.2) 31(3.408,-1.8) 32(3.408,-1.4) 33(3.408,-1) 34(3.408,-0.6) 35(3.408,-0.2) 36(3.408,0.2) 37(3.408,0.6) 38(3.408,1) 39(3.408,1.4) 40(3.408,1.8) 41(3.408,2.2) 42(3.408,2.6)
  rect 0.2x0.665 smd: 15(-2.6,-3.408) 16(-2.2,-3.408) 17(-1.8,-3.408) 18(-1.4,-3.408) 19(-1,-3.408) 20(-0.6,-3.408) 21(-0.2,-3.408) 22(0.2,-3.408) 23(0.6,-3.408) 24(1,-3.408) 25(1.4,-3.408) 26(1.8,-3.408) 27(2.2,-3.408) 28(2.6,-3.408) 43(2.6,3.408) 44(2.2,3.408) 45(1.8,3.408) 46(1.4,3.408) 47(1,3.408) 48(0.6,3.408) 49(0.2,3.408) 50(-0.2,3.408) 51(-0.6,3.408) 52(-1,3.408) 53(-1.4,3.408) 54(-1.8,3.408) 55(-2.2,3.408) 56(-2.6,3.408)
  rect 4x4 smd: 57(0,0)
R0402
  rect 0.566x0.54 smd: 1(-0.433,0) 2(0.433,0)
R0603
  rect 0.806x0.864 smd: 1(-0.753,0) 2(0.753,0)
RES-ARRAY-SMD_0603-8P-L3.2-W1.6-BL
  rect 0.65x0.8 smd: 1(-1.2,-0.9) 4(1.2,-0.9) 5(1.2,0.9) 8(-1.2,0.9)
  rect 0.5x0.8 smd: 2(-0.4,-0.9) 3(0.4,-0.9) 6(0.4,0.9) 7(-0.4,0.9)
SOD-123_L2.8-W1.8-LS3.7-RD
  rect 0.95x1.15 smd: 1(-1.692,0) 2(1.692,0)
SOIC-8_L5.3-W5.3-P1.27-LS8.0-BL
  oval 0.63x2.25 smd: 1(-1.905,-3.53) 2(-0.635,-3.53) 3(0.635,-3.53) 4(1.905,-3.53) 5(1.905,3.53) 6(0.635,3.53) 7(-0.635,3.53) 8(-1.905,3.53)
SOT-23-3_L2.9-W1.6-P1.90-LS2.8-BR
  rect 1.07x0.6 smd: 1(1.235,-0.95) 2(1.235,0.95) 3(-1.235,0)
SOT-23-6_L2.9-W1.6-P0.95-LS2.8-BL
  rect 0.532x1.072 smd: 1(-0.95,-1.149) 2(0,-1.149) 3(0.95,-1.149) 4(0.95,1.149) 5(0,1.149) 6(-0.95,1.149)
TQFP-48_L7.0-W7.0-P0.50-LS9.0-BL
  oval 0.28x1.8 smd: 1(-2.75,-4.05) 2(-2.25,-4.05) 3(-1.75,-4.05) 4(-1.25,-4.05) 5(-0.75,-4.05) 6(-0.25,-4.05) 7(0.25,-4.05) 8(0.75,-4.05) 9(1.25,-4.05) 10(1.75,-4.05) 11(2.25,-4.05) 12(2.75,-4.05) 25(2.75,4.05) 26(2.25,4.05) 27(1.75,4.05) 28(1.25,4.05) 29(0.75,4.05) 30(0.25,4.05) 31(-0.25,4.05) 32(-0.75,4.05) 33(-1.25,4.05) 34(-1.75,4.05) 35(-2.25,4.05) 36(-2.75,4.05)
  oval 1.8x0.28 smd: 13(4.05,-2.75) 14(4.05,-2.25) 15(4.05,-1.75) 16(4.05,-1.25) 17(4.05,-0.75) 18(4.05,-0.25) 19(4.05,0.25) 20(4.05,0.75) 21(4.05,1.25) 22(4.05,1.75) 23(4.05,2.25) 24(4.05,2.75) 37(-4.05,2.75) 38(-4.05,2.25) 39(-4.05,1.75) 40(-4.05,1.25) 41(-4.05,0.75) 42(-4.05,0.25) 43(-4.05,-0.25) 44(-4.05,-0.75) 45(-4.05,-1.25) 46(-4.05,-1.75) 47(-4.05,-2.25) 48(-4.05,-2.75)
USB-C-SMD_TYPE-C-6PIN-2MD-073
  rect 0.55x1.1 smd: 1(-3.2,2.375) 2(-2.4,2.375) 11(2.4,2.375) 12(3.2,2.375)
  rect 0.3x1.1 smd: 3(-1.75,2.375) 4(-1.25,2.375) 5(-0.75,2.375) 6(-0.25,2.375) 7(0.25,2.375) 8(0.75,2.375) 9(1.25,2.375) 10(1.75,2.375)
  oval 1.1x2 hole 0.6x1.5: 13(-4.325,1.825) 14(4.325,1.825)
  oval 1.2x1.8 hole 0.6x1.2: 13(-4.325,-2.375) 14(4.325,-2.375)

## Nets
As in the schematic.

Pads without a net: CN20 0; CN21 3 4; CN22 3 4; CN23 3 4; CN24 3 4; CN25 3 4; CN26 3 4; CN27 3 4; CN28 3 4; CN29 3 4; CN30 3 4; CN31 3 4; CN32 3 4; CN33 3 4; CN34 3 4; CN35 3 4; CN36 3 4; CN37 3 4; CN38 3 4; U22 8 28 38 39 40 41 42 47 48 51 52; U23 2; U24 4 6 7 8 13 14 15 16; U27 2 3 4 6 8 10; U36 22 23 24 31 35 45 46; U42 22 23 24 31 35 45 46; U44 22 23 24 31 35 45 46; U46 22 23 24 31 35 45 46; U48 22 23 24 31 35 45 46; U50 22 23 24 31 35 45 46; USB3 3 9

## Via types
v1: diameter 0.6, hole 0.299, Top Layer to Bottom Layer, 358 vias
v2: diameter 0.6, hole 0.3, Top Layer to Bottom Layer, 19 vias

## Routing (per net, layer and track width the routed paths; a pad name or vN(x,y) marks a point on that pad's centre or on a via; arc(x,y) is an arc through that point)
3V3: length 209.3
  Top Layer w0.203: v1(45.34,35.62) U22.46 43.3,35.62 42.53,36.39 42.53,36.5 C34.2 ; R211.1 63.59,36.45 RN15.7 ; 49.37,21.57 49.37,20.31 C20.2 ; CN20.6 34.84,39.86 v1(34.83,39.86) ; R30.2 v1(36.36,24.82) ; R23.2 v1(39.63,21.91)
  Top Layer w0.254: U21.2 41.04,54.02 40.44,53.42 29.63,53.42 29.17,53.88 R22.2 ; v1(49.42,22.46) 49.42,21.62 49.37,21.57 ; 71.2,40.41 v1(70.02,41.59) ; 71.2,40.41 U50.34 ; 71.2,40.41 71.7,39.91 71.7,38.95 ; C26.2 C27.1 43.15,31.22 43.55,31.62 U22.56 U22.55 ; 53.71,33.1 53.18,33.62 U22.20 ; U24.1 49.37,21.57 ; 49.37,21.57 49.38,21.57 C19.2 C20.2
  Top Layer w0.3: C35.2 C36.2 53.71,33.1 54.03,33.43 v1(55.59,33.43)
  Top Layer w0.508: RN15.8 RN15.7 RN15.6 RN15.5
  Bottom Layer w0.203: 95.65,52.83 95.65,52.84 95.65,54.04 94.44,54.04 94.35,54.13 ; 95.65,20.69 C163.2 v1(100.01,20.69) ; 95.65,20.69 95.65,19.48 U46.1 ; 95.65,20.69 94.44,20.69 U46.48 ; U44.33 30.1,79.37 30.6,78.87 v1(30.6,77.14) 29.99,77.75 29.99,78.61 29.73,78.87 U44.34 ; U36.34 30.64,14.97 v1(30.65,14.97) ; 20.56,12.76 21.77,12.76 U36.48 ; 20.56,12.76 20.56,13.97 U36.1 ; 20.56,12.76 v1(20.22,12.76) v1(15.66,12.76) ; U42.48 21.76,44.51 20.55,44.51 ; U42.34 30.64,46.73 v1(30.64,46.72) ; U42.1 20.55,45.72 20.55,44.51 ; 20.55,76.66 21.76,76.66 U44.48 ; 20.55,76.66 20.55,77.86 U44.1 ; 20.55,76.66 v1(20.22,76.66) C156.2 v1(15.61,76.66) ; RN13.7 90.02,58.8 R210.1 ; v1(15.56,44.51) C149.2 20.55,44.51 ; C165.2 99.39,24.87 100.01,24.25 v1(100.01,22) ; v1(81.55,54.13) 83.64,54.13 85.94,51.83 87.55,51.83
  Bottom Layer w0.254: 94.35,54.13 94.35,54.13 94.35,55.08 94.75,55.48 97.27,55.48 97.84,56.05 C171.2 C172.2 v1(97.84,62.09) ; v1(82.75,21.37) 86.72,25.34 RN11.5 RN11.7 ; U36.33 U36.34 ; U42.33 U42.34 ; U42.48 21.84,43.37 21.44,42.97 19.99,42.97 19.51,42.49 C150.2 C151.2 ; C165.2 C164.2 97.84,22.56 97.4,22.12 94.75,22.12 94.35,21.72 94.35,20.78 U46.48 ; C130.2 C129.2 19.52,10.74 20,11.22 21.45,11.22 21.85,11.62 U36.48 ; v1(100.01,54.04) C170.2 95.65,54.04 ; C158.2 C157.2 19.51,74.64 19.99,75.11 21.44,75.11 21.84,75.52 U44.48 ; U46.33 U46.34 85.54,18.47 v1(84.56,19.45) ; R209.1 90.03,25.46 RN11.7 ; v1(30.6,77.14) 30.6,74.02 28.58,72 RN9.5 RN9.6 RN9.7 RN9.8 24.45,72 R208.1 ; RN11.7 90.72,25.34 ; U48.33 87.55,51.83
  Bottom Layer w0.385: v1(34.83,39.86) RN7.5 RN7.6 RN7.7 RN7.8 24.45,39.86 R207.1 ; 89.92,58.67 90.69,58.67 90.72,58.7 ; R204.1 24.46,8.1 RN1.8 RN1.7 RN1.6 RN1.5 v1(29.33,8.1) ; v2(83.08,58.67) 89.12,58.67
  Bottom Layer w0.508: 48,30.52 48,28.71 C25.2 C24.2 51.1,28.71 51.51,28.3 v1(51.51,27.51) ; 89.12,58.7 RN13.7
  vias: v1(20.45,44.51) v1(42.59,61.37) v1(42.59,60.1) v1(42.59,58.83) v1(42.9,31.63) v1(46.56,61.37) v1(46.56,60.1) v1(46.56,58.83) v1(62.99,36.13) v1(68.68,31.03) v1(68.68,30.21)
5V:
  vias: v1(28.55,87.97) v1(28.55,87.14) v1(33.1,94.68) v1(38.71,66.99) v1(38.71,66.02) v1(39.2,94.58) v1(39.2,93.22) v1(40.7,66.99) v1(40.7,66.02)
GND: length 769.5
  Top Layer w0.203: v1(71.25,41.59) 72.2,40.63 U50.32 ; 91.24,35.88 92.88,35.88 C68.2 ; X8.2 v1(79.58,39.96) ; 91.29,49.08 92.87,49.08 C71.1 ; C26.1 41.81,29.3 v2(41,29.3) ; C62.2 92.77,3.69 89.76,3.69 ; 67.15,32.37 67.15,33.72 67.59,34.15 U50.44 ; 67.15,32.37 67.44,32.65 U50.47 ; 67.15,32.37 67.15,31.62 ; C72.2 92.42,57.19 91.24,57.19 ; 24.84,25.52 24.58,25.27 C49.1 ; U50.36 70.2,38.37 v2(69.72,38.37) ; 24.94,57.81 24.6,57.47 C55.1 ; v1(74.45,32.15) 74.7,31.9 74.7,29.73 v1(74.45,29.48) 74.2,29.72 U50.9 ; C63.1 89.82,5.9 89.76,5.84 ; v1(50.49,22.46) C19.1 C20.1 ; C33.1 41.25,38.52 v2(41.46,38.73) ; CN20.5 v2(35.84,39.87) ; 40.32,20.59 v1(40.32,18.74) ; C183.1 66.81,31.27 67.15,31.62 ; 70.08,28.49 70.08,29.05 70.7,29.67 70.7,30.85 ; v1(55.59,32.41) 55.05,32.41 C36.1 C35.1 v1(55.59,31.47) ; C53.1 23.75,48.87 v1(24.84,47.77) ; C59.1 23.99,80.77 v1(24.84,79.91) ; C51.1 22.64,38.02 v1(23.17,37.49) ; 67.15,31.62 67.15,30.12 66.85,29.82 64.75,29.82 64.7,29.76 ; v1(85.68,1.3) v1(83.06,1.3) ; U26.4 v1(45.83,48.37) ; v1(23.18,5.73) 22.9,6.01 C45.1 ; 75.7,30.85 v1(76.29,30.85) ; 24.89,70.4 24.56,70.07 C57.1 ; 26.32,3.9 26.28,3.94 21.87,3.94 ; C32.1 v2(42.48,38.27) ; C70.2 91.29,47.03 ; U25.4 v2(35.09,32.42)
  Top Layer w0.245: C59.1 C58.2
  Top Layer w0.254: 21.87,16.69 C46.2 ; C43.1 25.4,89.57 C61.1 C60.2 26.09,91.65 26.27,91.82 ; SW4.2 36.55,28.22 36.86,27.91 C41.1 ; 92.89,37.92 C68.2 ; v1(24.89,62.22) 24.89,60.05 24.39,59.55 C54.2 C55.1 ; 61.91,22.38 63.65,22.38 ; 61.91,22.38 v1(61.91,20.83) ; 61.91,22.38 C74.2 ; 63.65,22.38 v1(63.65,20.83) ; 63.65,22.38 C75.1 ; 92.89,49.08 v1(92.89,48.09) C70.2 ; 92.89,16.97 v1(92.89,15.94) ; v1(76.32,20.83) 76.32,22.38 78.06,22.38 ; 21.87,68.95 24.66,68.95 v1(24.68,68.97) ; 21.87,68.95 C57.1 ; 21.87,68.95 C56.2 ; 89.81,59.44 89.86,59.48 C73.1 92.63,57.44 ; 78.06,22.38 v1(78.06,20.83) ; 78.06,22.38 C79.1 ; 74.84,27.19 74.92,27.27 74.92,29 v1(74.45,29.48) ; v1(69.1,20.83) 69.1,22.38 70.84,22.38 v1(70.84,20.83) ; C67.1 C66.2 ; C53.1 C52.2 ; C51.1 C50.2 ; C47.1 24.1,16.72 24.85,15.97 ; 21.87,5.99 21.87,3.94 ; C64.2 91.3,14.92 v1(90.84,15.38) ; 92.89,5.87 C62.2 ; C69.1 91.93,38.01 v1(91.32,37.41) ; 21.87,27.32 C49.1 ; C48.2 24.42,27.35 24.89,27.82 v1(24.89,30.93)
  Top Layer w0.508: LED25.1 U51.1 LED24.1 LED23.1
  Bottom Layer w0.203: 20.55,18.46 16.89,18.46 ; 20.55,18.46 22.36,18.46 22.36,19.22 22.11,19.47 ; 20.55,18.46 U36.9 ; 93.85,48.29 95.61,48.29 U48.10 95.65,48.34 ; 93.85,48.29 93.85,47.58 94.1,47.33 U48.12 v2(95.65,46.64) ; 93.85,48.29 93.85,48.29 93.85,48.83 ; X7.4 86.24,43.12 v1(88.38,43.12) ; C153.1 C152.1 20.54,50.21 ; v1(78.06,20.83) v1(76.32,20.83) v1(70.84,20.83) v1(69.1,20.83) v1(63.65,20.83) v1(61.91,20.83) ; 18.19,8.46 20.16,8.46 ; U46.47 93.85,22.25 94.32,22.72 ; 92.62,62.09 88.79,62.09 88.38,61.68 v1(88.38,60.1) ; 92.62,62.09 v1(95.19,62.09) 95.19,58.23 ; 92.62,62.09 92.3,61.77 C206.1 ; 22.1,83.37 U44.12 v2(20.54,84.17) ; 22.1,83.37 22.35,83.12 22.35,82.36 20.54,82.36 ; 22.1,83.37 23.49,83.37 v1(24.84,82.01) ; 22.11,19.47 U36.12 20.55,19.47 v1(20.55,20.37) ; 22.11,19.47 23.5,19.47 v1(24.85,18.12) ; 94.32,22.72 93.23,22.72 92.35,21.84 U46.44 92.35,18.97 ; 94.32,22.72 94.81,22.72 ; 22.71,14.47 24.13,14.47 ; 22.71,14.47 22.35,14.11 U36.47 ; 22.71,14.47 U36.2 18.63,14.47 18.19,14.03 C128.1 ; 24.13,14.47 24.72,14.47 ; 24.13,14.47 23.85,14.19 U36.44 23.85,11.52 22.95,10.62 20.6,10.62 20.15,10.17 20.15,8.47 20.16,8.46 ; v1(24.84,78.37) 22.7,78.37 ; v1(24.84,78.37) v1(24.84,79.91) ; v1(24.84,78.37) v1(26.89,78.37) 27.39,77.87 U44.36 ; 22.7,78.37 22.34,78.01 U44.47 22.34,74.89 21.97,74.51 ; 22.7,78.37 U44.2 18.8,78.37 C156.1 ; 93.85,52.33 U48.2 97.39,52.33 98.02,52.95 ; 93.85,52.33 93.85,48.83 ; 93.85,52.33 92.38,52.33 v1(92.36,52.35) ; 93.85,52.33 93.85,55.72 94.21,56.08 96.4,56.08 96.75,56.43 96.75,58.23 96.75,58.23 95.19,58.23 ; v1(20.16,72.36) 20.14,72.37 20.14,74.06 20.59,74.51 21.97,74.51 ; v1(20.16,72.36) C157.1 C158.1 ; v1(20.16,72.36) C162.1 C161.1 ; v1(81.55,55.15) 83.69,55.15 86.02,52.83 88.23,52.83 ; v1(24.84,46.23) 25.34,45.73 U42.36 v1(30.08,45.73) ; v1(24.84,46.23) 24.1,46.23 ; v1(24.84,46.23) v1(24.84,47.77) ; 90.85,17.47 90.85,18.97 ; 90.85,17.47 v1(90.85,17.47) 89.31,17.47 v1(89.31,17.47) U46.32 ; 90.85,17.47 90.85,15.39 v1(90.84,15.38) 91.25,14.97 91.35,14.97 ; 90.85,18.97 89.42,18.97 v1(89.3,19.09) 88.91,19.47 U46.36 v1(85.96,19.47) ; 90.85,18.97 92.35,18.97 ; U46.10 U46.9 93.36,15.47 v1(92.89,15.94) 92.35,16.47 92.35,18.97 ; U46.10 v1(97.2,14.97) 97.45,14.72 99.3,14.72 C167.1 ; U46.10 92.87,14.97 ; C205.1 92.66,25.32 v1(92.66,26.36) 94.79,26.36 95.27,25.88 95.27,24.95 C169.1 96.75,24.87 96.75,24.87 96.75,23.07 96.4,22.72 94.81,22.72 ; U48.19 v1(91.35,48.69) ; v1(91.35,48.69) 91.95,48.09 v1(92.89,48.09) 92.89,48.49 93.23,48.83 93.85,48.83 ; v1(91.35,48.69) 91.35,51.34 ; 20.54,82.36 C160.1 C159.1 15.89,82.36 15.61,82.64 v1(15.61,84.17) ; 20.54,82.36 U44.9 ; v1(23,68.98) 23,69.38 23.17,69.56 C204.1 24.61,69.56 24.68,69.48 24.68,68.97 v1(24.68,68.97) ; v1(24.84,79.91) 24.89,79.87 v1(26.89,79.87) U44.32 ; v1(24.84,79.91) v1(24.84,82.01) ; 20.14,40.23 20.14,41.92 20.59,42.37 22.94,42.37 23.84,43.27 U42.44 23.84,45.97 24.1,46.23 ; 95.19,58.23 C176.1 95.19,56.93 ; 93.85,48.83 95.65,48.83 95.65,48.34 ; v1(92.81,32.87) C197.1 92.82,34.42 ; 21.97,74.51 22.94,74.51 23.84,75.42 U44.44 ; v1(29.02,23.99) 30.28,23.99 X1.4 ; 92.35,18.97 U46.2 97.54,18.97 98.02,19.45 C163.1 ; 22.7,46.23 22.34,45.87 U42.47 ; 22.7,46.23 U42.2 18.8,46.23 C149.1 ; 22.7,46.23 24.1,46.23 ; v1(15.88,40.24) 15.91,40.21 C151.1 C150.1 C155.1 C154.1 ; X4.4 30.35,55.76 v1(30.35,56.43) ; v1(24.84,49.87) 23.49,51.23 22.1,51.23 ; v1(24.84,49.87) U42.19 ; v1(24.84,49.87) v1(24.84,47.77) ; 95.65,48.34 v2(97.01,48.34) 99.32,48.34 ; v1(24.84,82.01) U44.19 ; 30.08,15.97 U36.32 28.64,15.97 v1(24.85,15.97) ; 30.08,15.97 v1(30.09,15.99) ; 30.08,15.97 30.82,15.97 33.15,13.64 34.17,13.64 ; 20.16,8.46 22.19,8.46 ; X1.2 32.29,22.1 v1(33.2,22.1) ; 22.1,51.23 U42.12 20.55,51.23 v1(20.55,52.12) ; 22.1,51.23 22.35,50.97 22.35,50.21 20.54,50.21 ; 91.35,51.34 90.84,50.83 85.92,50.83 83.59,53.16 v1(81.55,53.16) ; 91.35,51.34 v1(92.36,52.35) ; 91.35,51.34 91.35,51.88 90.4,52.83 88.23,52.83 ; v1(84.56,12.72) 84.56,11.98 X6.2 ; 94.81,22.72 95.19,23.1 C168.1 ; v1(25.09,5.73) 25.09,6.6 C202.1 ; 25.08,38.36 25.08,37.74 v1(24.83,37.49) ; 91.35,14.97 92.87,14.97 ; 91.35,14.97 U46.19 ; v1(30.08,47.74) 30.07,47.73 U42.32 24.89,47.73 v1(24.84,47.77) ; v1(92.36,52.35) 92.36,54.12 92.35,54.13 ; X5.2 v1(32,84.22) ; X4.2 33.09,53.52 33.66,54.08 v1(33.66,56.12) v1(34.88,56.12) v1(35.7,56.12) ; 88.23,52.83 v1(88.23,53.93) ; v1(24.85,18.12) U36.19 ; v1(24.85,18.12) v1(24.85,15.97) ; X5.4 v1(29.58,87.42) ; 92.87,14.97 92.87,15.86 ; 92.87,14.97 92.87,14.46 93.36,13.97 U46.12 v2(95.65,13.44) ; X7.2 v1(84.2,46.02) ; v1(24.85,15.97) v1(24.85,14.47) 25.35,13.97 U36.36 v1(30.09,13.97) ; 20.54,50.21 U42.9 ; R213.1 v1(94.61,32.87) ; X6.4 v1(86.91,9.42) ; C113.1 18.67,61.12
  Bottom Layer w0.254: v1(35.24,96.69) v1(30.64,96.69) ; v1(28.47,63.47) v1(28.47,62.24) 28.47,61.76 C114.1 ; 18.67,61.12 v1(18.67,62.7) ; v1(24.89,62.22) 24.89,61.15 24.88,61.14 ; R189.1 v1(16.81,62.7)
  Bottom Layer w0.381: v2(42.48,38.27) 41.92,38.27 v2(41.46,38.73) ; v1(25.09,5.73) v1(23.18,5.73) 22.49,5.73 22.19,6.04 22.19,8.46 ; v2(35.84,39.87) 37.37,39.87 37.94,39.29 v2(37.94,36.95) ; v1(29.33,1) v1(29.33,3.36) v1(29.33,5.73) ; v2(49.82,54.68) 49.83,54.69 v2(49.83,56.48) v2(49.83,58.47) ; v1(15.66,7.42) 15.66,7.98 16.14,8.46 18.19,8.46 ; v2(54.98,54.68) 54.99,54.69 v2(54.99,56.48) v2(54.99,58.47) ; v1(24.83,37.49) v1(23.17,37.49) 22.48,37.49 22.18,37.79 C154.1 ; v1(51.33,44.79) 52.6,44.79 v1(52.63,44.82)
  Bottom Layer w0.385: 47.46,93.85 v1(48.5,93.85) ; 47.46,93.85 C116.1 ; 47.46,93.85 R192.1 v1(44.64,93.85) R223.1 ; v1(76.86,50.87) LED22.1 U49.1 LED21.1 LED20.1 77.92,44.51 v1(77.93,44.49) ; 24.89,29.43 v1(24.89,30.93) ; 24.89,29.43 R228.1 ; 24.89,29.43 R187.1 27.73,29.43 ; C114.1 27.75,61.14 R190.1 R225.1 ; 103.62,2.27 R220.1 ; 103.62,2.27 97.55,2.27 ; 103.62,2.27 105.47,2.27 v1(106.49,3.29) ; v1(37.94,62.4) 37.94,61.16 37.96,61.14 ; R229.1 R186.1 ; R186.1 18.66,29.33 ; R186.1 v1(16.91,30.83) ; LED13.1 38.28,47.64 38.28,49.49 v1(38.96,49.49) ; 38.3,81.16 38.3,82.95 38.3,82.95 v1(39.02,82.95) ; 38.3,81.16 LED16.1 ; 38.3,81.16 v1(39.02,81.16) ; 59.21,45.62 C201.1 ; 59.21,45.62 59.21,43.87 R217.1 ; 59.21,45.62 59.21,49.38 ; 103.61,34.43 C196.1 C122.1 ; 103.61,34.43 R212.1 ; 103.61,34.43 105.55,34.43 v1(106.49,35.37) ; v1(59.21,50.81) 59.21,50.81 59.21,49.38 ; 79.75,2.27 79.8,2.21 R197.1 83.06,2.21 ; 45.9,27.62 v1(45.9,28.31) v1(45.9,29.52) ; 45.9,27.62 C23.1 C25.1 C24.1 ; 45.9,27.62 45.21,27.62 v1(44.7,27.11) ; 45.9,27.62 v1(45.9,27.11) v1(45.9,25.9) ; 18.66,29.33 18.72,29.33 v1(18.72,30.83) ; 18.66,29.33 C110.1 ; 79.82,34.38 v1(78.77,34.38) 77.71,34.38 76.29,32.97 v1(76.29,30.85) ; 79.82,34.38 C124.1 ; 79.82,34.38 v1(80.75,34.38) R200.1 R214.1 ; 59.19,36.4 C200.1 ; 59.19,36.4 59.19,34.65 R216.1 ; 59.19,36.4 v1(59.19,37.47) v1(59.19,39.44) 59.19,40.26 C126.1 ; R221.1 v1(47.57,77.06) R194.1 47.57,74.25 C118.1 ; v1(44.7,27.11) v1(44.7,25.9) ; v1(44.7,27.11) v1(44.7,28.31) v1(44.7,29.52) ; R222.1 v1(47.57,86.22) R193.1 v1(47.57,82.55) ; C123.1 C197.1 94.56,34.43 R213.1 ; 36.83,61.14 C115.1 ; 36.83,61.14 37.96,61.14 ; 36.83,61.14 R191.1 R224.1 ; R188.1 v1(35.09,30.93) v2(35.09,32.42) ; R188.1 R227.1 ; R188.1 36.86,29.43 ; LED11.1 LED12.1 ; 88.64,2.27 v1(89.58,2.27) v1(91.32,2.27) 94.53,2.27 R219.1 ; R198.1 99.39,32.76 ; 36.86,29.43 C112.1 ; 36.86,29.43 v1(38.05,29.43) ; 27.73,29.43 C111.1 ; 27.73,29.43 v1(27.73,30.93) ; 37.96,61.14 39.44,61.14 40.7,62.4 v1(42.59,62.4) ; 83.06,2.21 85.68,2.21 v1(85.68,1.3) ; 83.06,2.21 v1(83.06,1.3) ; C127.1 59.21,49.38 ; LED19.1 U47.1 LED18.1 LED17.1 v1(77.92,10.99) ; U43.1 38.28,51.23 v1(38.96,51.23) ; C113.1 18.58,61.14 R189.1 R226.1 ; LED2.1 LED3.1 U37.1 LED4.1 38.46,16.09 v1(39.14,16.09) v1(41.23,16.09) v1(43.5,16.09) ; R215.1 v1(59.04,26.32) R201.1 59.04,31.2 C125.1 ; LED14.1 LED15.1
  Bottom Layer w0.6: R79.2 74.21,56.99 73.62,56.41 v1(69.85,56.41) ; v1(72.85,56.41) 72.85,56.42 v1(72.85,58.02)
  vias: v1(15.77,72.36) v1(20.16,40.24) v1(25.65,96.52) v1(25.65,94.88) v1(25.65,93.25) v1(27.08,96.52) v1(27.08,94.87) v1(27.08,93.24) v1(28.97,71.33) v1(29.43,66.42) v1(31.06,71.32) v1(31.82,66.42) v1(33.21,74.43) v1(33.21,72.98) v1(34.94,74.43) v1(34.94,72.98) v1(36.47,95.75) v1(37.94,95.75) v1(39.14,14) v1(39.17,12.39) v1(39.17,10.78) v1(41.23,14) v1(41.26,12.39) v1(41.26,10.78) v1(42.68,54.68) v1(43.5,14) v1(43.95,54.68) v1(44.36,72.41) v1(44.36,70.97) v1(44.7,22.87) v1(44.82,20.47) v1(44.82,18.76) v1(45.2,54.68) v1(45.6,19.62) v1(46.09,72.41) v1(46.09,70.97) v1(46.38,20.47) v1(46.38,18.76) v1(46.47,54.68) v1(49,14) v1(50.29,9.14) v1(50.29,6.62) v1(50.29,4.25) v1(51.27,16.09) v1(51.27,14) v1(52.22,39.9) v1(52.29,4.25) v1(53.55,16.09) v1(53.55,14) v1(53.58,12.36) v1(53.58,10.75) v1(53.58,9.14) v1(54.77,27.72) v1(55.64,16.09) v1(55.64,13.97) v1(55.67,12.36) v1(55.67,10.75) v1(55.67,9.14) v1(56.81,4.25) v1(58.81,4.25) v1(59.21,46.64) v1(63.75,31.29) v1(67.32,31.34) v1(69.97,29.4) v1(71.2,34.14) v1(71.35,56.4) v1(71.81,32.66) v1(99.39,32.82) v2(33.61,86.37)
V1N: length 11.5
  Bottom Layer w0.203: U36.14 22.35,24.87 21,26.22 19.2,26.22 18.71,26.71 C110.2 18.66,27.82 R186.2
V1P: length 20.5
  Bottom Layer w0.203: U36.13 21.85,24.57 20.7,25.72 15.15,25.72 14.65,26.22 C184.2 14.59,27.82 R229.2 12.84,27.82 12.1,27.82 11.65,28.27 11.65,30.77 12.15,31.27 R235.1
V2N: length 12.4
  Bottom Layer w0.203: U36.16 23.35,25.27 24.9,26.82 27.45,26.82 27.78,27.15 C111.2 27.73,27.92 R187.2
V2P: length 14.7
  Bottom Layer w0.203: U36.15 22.85,25.23 21.92,26.17 21.92,27.82 ; 21.92,27.82 21.91,27.82 21.17,27.82 20.72,28.27 20.72,30.77 21.22,31.27 R234.1 ; 21.92,27.82 R228.2 23.66,27.92 C185.2
V3N: length 20.8
  Bottom Layer w0.203: R188.2 36.86,27.92 C112.2 37,27.89 37,26.27 36.46,25.73 25.46,25.73 24.35,24.62 U36.18
V3P: length 22.3
  Bottom Layer w0.203: R227.2 32.86,27.92 C186.2 32.92,26.78 32.42,26.29 25.17,26.29 23.85,24.97 U36.17 ; 31.12,27.82 31.11,27.82 30.36,27.82 29.92,28.27 29.92,30.77 30.42,31.27 R233.1
V4N: length 11.5
  Bottom Layer w0.203: U42.14 22.34,56.62 20.99,57.97 19.19,57.97 18.7,58.46 18.7,59.63 18.65,59.58 16.9,59.58
V4P: length 20.5
  Bottom Layer w0.203: 12.83,62.98 12.13,62.98 11.63,62.48 11.63,59.98 12.08,59.53 12.83,59.53 12.83,59.53 ; 12.84,59.57 12.84,59.58 14.58,59.58 14.64,59.63 14.64,57.97 15.14,57.47 20.69,57.47 21.84,56.32 U42.13
V5N: length 12.4
  Bottom Layer w0.203: 25.97,59.67 27.72,59.67 27.77,59.73 27.77,58.9 27.44,58.57 24.89,58.57 23.34,57.02 U42.16
V5P: length 14.6
  Bottom Layer w0.203: C188.2 23.68,59.63 21.93,59.63 ; 21.93,62.98 21.23,62.98 20.73,62.48 20.73,59.98 21.18,59.53 21.91,59.53 ; U42.15 22.84,56.99 21.91,57.92 21.91,59.53 ; 21.91,59.53 21.93,59.53 21.93,59.53 ; 21.91,59.53 21.91,59.58
V6N: length 18.6
  Bottom Layer w0.203: U42.18 24.34,56.37 25.39,57.42 34.29,57.42 35.06,58.18 35.06,59.63
  Bottom Layer w0.254: C115.2 36.83,59.63 35.06,59.63
V6P: length 22.3
  Bottom Layer w0.203: U42.17 23.84,56.72 25.09,57.97 32.34,57.97 32.91,58.54 32.91,59.73 32.85,59.67 31.11,59.67 ; 31.08,59.53 31.08,59.53 30.33,59.53 29.88,59.98 29.88,62.48 30.38,62.98 31.08,62.98
V7N: length 31.1
  Bottom Layer w0.254: C116.2 47.46,92.34 R192.2 45.71,91.48 45.1,90.87 24.75,90.87 22.34,88.46 U44.14
V7P: length 32.5
  Bottom Layer w0.203: R223.2 42.05,92.34
  Bottom Layer w0.254: R242.1 40.76,95.51 40.44,95.19 40.44,92.59 40.75,92.28 41.59,92.28 R223.2 41.65,92.3 40.73,91.37 24.55,91.37 21.84,88.66 U44.13 ; 43.45,92.39 43.4,92.34 42.05,92.34
V8N: length 33.1
  Bottom Layer w0.203: C117.2 46.12,85.09 R193.2
  Bottom Layer w0.254: U44.16 23.34,87.96 25.25,89.87 41.2,89.87 44.45,86.62 44.45,83.72 44.83,83.34 C117.2
V8P: length 36.1
  Bottom Layer w0.203: R222.2 46.12,89.15 C191.2
  Bottom Layer w0.254: C191.2 44.56,87.4 41.6,90.37 25,90.37 22.84,88.21 U44.15 ; 49.23,89.1 49.23,89.99 48.91,90.31 46.31,90.31 46,90 46,89.16 46.06,89.1
V9N: length 39.6
  Bottom Layer w0.254: R194.2 46.12,75.98 C118.2 44.01,74.2 43.3,74.92 43.3,86.07 40.5,88.87 25.7,88.87 24.34,87.51 U44.18
V9P: length 42.3
  Bottom Layer w0.203: C192.2 46.12,79.95 R221.2
  Bottom Layer w0.254: C192.2 44.31,78.2 43.85,78.67 43.85,86.42 40.9,89.37 25.5,89.37 23.84,87.71 U44.17 ; 49.23,79.85 49.23,80.74 48.91,81.06 46.31,81.06 46,80.75 46,79.91 46.06,79.85
V10N: length 12.4
  Bottom Layer w0.203: R195.2 99.32,3.67 C119.2
  Bottom Layer w0.254: C119.2 97.55,5.41 93.85,9.11 U46.14
V10P: length 17.6
  Bottom Layer w0.254: U46.13 94.35,9.51 97.9,5.97 101.35,5.97 101.85,5.47 C193.2 103.62,3.67 R220.2 R245.1
V11N: length 12.6
  Bottom Layer w0.254: 88.64,3.72 R196.2 ; 88.64,3.72 88.64,5.26 92.85,9.47 U46.16 ; 88.64,3.72 C120.2
V11P: length 12.6
  Bottom Layer w0.254: U46.15 93.35,9.12 92.8,8.57 C194.2 94.52,3.67 R219.2 94.58,5.32
V12N: length 20.4
  Bottom Layer w0.254: R197.2 81.5,3.67 C121.2 79.75,5.86 81.76,7.87 89.55,7.87 91.85,10.17 U46.18
V12P: length 19
  Bottom Layer w0.254: R247.1 R218.2 83.95,3.72 83.95,3.72 C195.2 83.9,6.57 84.5,7.17 89.7,7.17 92.35,9.82 92.35,12.62 ; 92.35,12.62 U46.17
V13N: length 13.6
  Bottom Layer w0.203: 99.32,35.85 99.38,35.91
  Bottom Layer w0.254: 99.32,35.85 97.55,35.85 97.55,38.22 93.85,41.91 U48.14
V13P: length 19.1
  Bottom Layer w0.254: U48.13 94.35,42.36 97.39,39.33 101.35,39.33 101.85,38.83 101.85,35.85 103.62,35.85 103.68,35.91 103.68,37.51
V14N: length 13.7
  Bottom Layer w0.254: U48.16 92.85,42.32 88.64,38.11 88.64,35.91 90.44,35.91
V14P: length 13.8
  Bottom Layer w0.254: U48.15 93.35,41.87 92.8,41.32 92.8,35.85 94.52,35.85 94.58,35.91 94.58,37.51
V15N: length 20.4
  Bottom Layer w0.254: U48.18 91.85,43.07 89.65,40.87 82.51,40.87 81.59,39.94 R200.2 81.54,35.83 C124.2
V15P: length 20.1
  Bottom Layer w0.254: R214.2 85.71,37.54 ; 85.68,35.91 83.95,35.91 83.95,39.67 84.5,40.22 89.9,40.22 92.35,42.67 92.35,45.98
V16N: length 27.9
  Top Layer w0.203: U50.14 78.6,32.65 79.05,32.2 v1(79.05,31.23)
  Bottom Layer w0.254: R201.2 60.54,31.2 C125.2 61.34,31.25 61.78,30.81 61.78,28.36 62.32,27.82 75.63,27.82 v1(79.05,31.23)
V16P: length 26.6
  Top Layer w0.203: v1(78.85,30.06) 78.39,30.52 78.39,31.9 78.13,32.15 U50.13
  Bottom Layer w0.254: R238.1 R215.2 60.54,27.25 ; C199.2 60.54,27.25 ; 60.54,27.25 76.03,27.25 v1(78.85,30.06)
V17N: length 23.5
  Top Layer w0.203: U50.16 74.51,33.65 73.05,35.12 v1(73.05,37.25)
  Bottom Layer w0.254: v1(73.05,37.25) 73.05,39.17 71.86,40.36 C126.2 60.54,40.31 R202.2
V17P: length 27.5
  Top Layer w0.203: U50.15 74.16,33.15 72.2,35.12 v1(72.2,37.25)
  Bottom Layer w0.254: v1(72.2,37.25) 72.2,38.92 71.7,39.42 62.2,39.42 61.8,39.02 61.8,36.82 61.28,36.3 C200.2 60.54,36.25 R216.2 R237.1
V18N: length 31.4
  Top Layer w0.203: U50.18 75.21,34.65 74.75,35.12 v1(74.75,37.25)
  Bottom Layer w0.254: v1(74.75,37.25) 74.75,46.82 72.07,49.5 C127.2 60.54,49.45 R203.2
V18P: length 35.6
  Top Layer w0.203: U50.17 74.81,34.15 73.9,35.07 v1(73.9,37.25)
  Bottom Layer w0.254: v1(73.9,37.25) 73.9,46.37 71.65,48.62 62.2,48.62 61.8,48.22 61.8,46.02 61.28,45.5 C201.2 60.49,43.7 62.6,43.7
VCC:
  vias: v1(56.6,63.04) v1(56.6,60.21) v1(59.1,63.04) v1(59.1,60.21) v1(65.55,58.02) v1(65.55,56.41) v1(67.05,56.4) v1(68.55,56.41)
VDD_SPI: length 7.4
  Top Layer w0.254: U26.8 C37.2 51.05,42.74 51.05,38.52 50.5,37.97 U22.29
VIN: length 3
  Top Layer w0.254: U20.3 34.13,59.16 33.01,59.16 32.83,58.98 32.83,58.38 32.67,58.22 U20.5
AC9V_N: length 7.8
  Bottom Layer w0.6: R79.1 74.2,62.24 U27.9
AC9V_P: length 502.4
  Inner2 w0.6: v1(54.32,97.02) 54.32,98.24 53.35,99.22 7.85,99.22 5.56,96.92 v1(5.56,64.88)
  Bottom Layer w0.254: R247.2 87.19,0.84 ; R239.2 87.23,31.34 ; R246.2 96.09,0.84 ; 23.42,32.97 R234.2 ; 54.32,89.18 54.3,89.2 R243.2 ; R242.2 v1(54.32,97.02) ; 32.62,32.97 R233.2 ; R240.2 96.08,31.42 96.17,31.34 ; 14.36,32.97 14.36,31.27
  Bottom Layer w0.385: R237.2 58.22,32.99 57.22,32 ; R236.2 57.78,42.19 57.22,41.64 57.22,32 ; R238.2 58.14,23.94 57.22,24.86 57.22,32
  Bottom Layer w0.4: 23.44,64.89 R231.2 ; 87.19,0.84 108.38,0.84 109.6,2.06 109.6,6.83 ; 14.34,64.89 R232.2
  Bottom Layer w0.5: 54.32,80.02 v1(54.32,97.02) ; 109.6,6.83 R245.2 ; 54.31,80.02 54.34,79.99 ; R238.2 75.28,23.94 82.68,31.34 109.6,31.34 ; 32.62,32.97 6.27,32.97 5.56,33.68 v1(5.56,64.88) 5.58,64.89 32.08,64.89 32.59,64.38 R230.2 ; 109.6,39.02 R241.2
  Bottom Layer w0.6: 64.2,79.99 50.75,79.99 R244.2 ; 64.2,79.99 U27.7 ; 64.2,79.99 110.93,79.99 112.56,78.36 112.56,72.95 109.6,70 109.6,6.83
ANT1: length 11.6
  Top Layer w0.343: C15.2 40.96,15.12 40.14,14.3 U23.1 40.14,7.52
ANT2: length 18.4
  Top Layer w0.343: RF1.5 54.55,14.43 53.85,15.12 C16.2
ANT_CTRL: length 10.4
  Top Layer w0.203: U22.6 47.3,30.09 47.58,29.81 47.58,24.09 47.36,23.87 46.77,23.87 45.93,23.03 U24.2
ANT_EN: length 17.9
  Top Layer w0.203: R23.1 41.3,20.7 C21.2 ; U22.7 47.7,30.25 48.04,29.91 v1(48.04,22.87) ; U24.5 v1(43.65,21.95)
  Top Layer w0.254: C21.2 U24.5
  Bottom Layer w0.203: v1(48.04,22.87) 48.04,22.77 47.23,21.95 v1(43.65,21.95)
CS1: length 44.7
  Top Layer w0.203: U22.10 48.9,26.04 49.42,25.52 v1(49.42,24.3) ; v1(42.39,23.47) 41.79,22.87 32.03,22.87 27.89,18.73 v1(27.89,9.12)
  Bottom Layer w0.203: v1(49.42,24.3) 48.04,24.3 47.21,23.47 v1(42.39,23.47) ; U36.37 27.35,11.02 27.9,10.47 27.9,9.13 v1(27.89,9.12) RN1.4
CS2: length 48.6
  Top Layer w0.203: v1(27.88,40.87) 28.51,40.24 28.51,26.95 32.03,23.43 41.47,23.43 v1(42.39,24.35) ; U22.11 49.3,26.41 50.08,25.62 v1(50.08,24.91)
  Bottom Layer w0.203: U42.37 27.34,42.77 27.89,42.22 27.89,40.88 v1(27.88,40.87) RN7.4 ; v1(50.08,24.91) 47.79,24.91 47.23,24.35 v1(42.39,24.35)
CS3: length 81.7
  Top Layer w0.203: v1(51.51,25.52) 50.85,25.52 49.7,26.67 U22.12 ; v1(42.38,25.22) 41.16,23.99 32.23,23.99 29.07,27.15 29.07,40.77 27.88,41.96 v1(27.88,73.02)
  Bottom Layer w0.203: 27.89,73.8 27.89,74.36 27.34,74.91 U44.37 ; 27.89,73.8 v1(27.88,73.02) 27.89,73.03 27.89,73.8 ; v1(51.51,25.52) 47.48,25.52 47.18,25.22 v1(42.38,25.22)
CS4: length 53.2
  Top Layer w0.203: U22.13 50.1,26.93 50.9,26.13 54.83,26.13 55.34,25.62 v1(55.34,23.69)
  Bottom Layer w0.203: U46.37 88.85,22.36 88.32,22.9 RN11.4 86.76,23.54 83.13,19.91 56.1,19.91 54.62,21.39 54.62,23.38 54.93,23.69 v1(55.34,23.69)
CS5: length 71.1
  Top Layer w0.203: v1(67.17,41.59) 59.72,41.59 58.55,40.41 58.55,28.23 56.97,26.64 51.1,26.64 50.5,27.25 U22.14 ; v1(67.17,53.16) v1(67.17,44.7)
  Bottom Layer w0.203: v1(67.17,44.7) v1(67.17,41.59) ; v1(67.17,53.16) 77.16,53.16 80.9,56.9 RN13.4 88.32,56.26 88.85,55.72 88.85,54.13
CS6: length 38.5
  Top Layer w0.203: RN15.4 66.28,38.19 66.82,37.65 U50.37 68.9,41.74 68.44,42.2 59.52,42.2 58.04,40.72 58.04,30.21 57.27,29.45 52.44,29.45 51.53,30.36 51.53,31.62 U22.15
ESP_EN: length 28.6
  Top Layer w0.203: U22.4 46.5,31.35 v1(46.13,31.72) 45.4,31.72 43.95,30.27 43.95,28.77 43.4,28.22 SW4.1 ; CN20.1 39.84,41.46 v1(39.83,41.46)
  Top Layer w0.254: SW4.1 38.15,28.22 37.83,27.9 37.83,24.82
  Bottom Layer w0.203: v1(46.13,31.72) 39.83,38.02 v1(39.83,41.46)
GPIO0: length 24.6
  Top Layer w0.203: v1(40.55,40.82) 39.42,40.82 38.84,41.41 CN20.2 ; SW3.1 51.26,28.22 51,28.48 51,31.12 50.4,31.72 v1(47.27,31.72) 46.9,31.35 U22.5
  Bottom Layer w0.203: v1(40.55,40.82) 40.55,38.44 v1(47.27,31.72)
I1+: length 14.8
  Top Layer w0.254: R31.1 9.46,2.48 CN21.2 ; 13.98,2.68 14.24,2.42 15.95,2.42 17.04,3.51 U29.4
I1-: length 21.6
  Top Layer w0.254: 13.98,7.43 13.98,9.57 14.42,10 U29.3 ; CN21.1 5.99,1.71 6.8,2.52 6.8,5.82 7.65,6.67 13.15,6.67 13.7,7.22 13.98,7.22
I1N: length 36.5
  Top Layer w0.244: C45.2 20.25,7.41 19.85,7.02 v1(19.85,3.52)
  Top Layer w0.254: U29.6 21.46,10 21.9,9.57 21.9,7.41
  Bottom Layer w0.203: U36.4 14.14,15.47 13.45,14.78 13.45,3.97 14.65,2.77 19.2,2.77 19.85,3.42 v1(19.85,3.52)
I1P: length 31.2
  Top Layer w0.254: 21.9,2.68 21.74,2.52 19.85,2.52 v1(18.84,3.53) U29.5
  Bottom Layer w0.203: v1(18.84,3.53) 14.79,3.53 14.05,4.27 14.05,14.48 14.54,14.97 U36.3
I2+: length 10.6
  Top Layer w0.254: CN22.2 9.46,13.18 R33.1 ; U29.2 14.42,10.8 13.98,11.24 13.98,13.14
I2-: length 25.2
  Top Layer w0.254: CN22.1 5.99,12.41 6.8,13.22 6.8,16.52 7.65,17.37 13.15,17.37 13.7,17.92 13.98,17.92 ; 13.98,18.12 16.1,18.12 17.04,17.18 U29.1
